# EAGLE board BMSTEST-v1.1 (EAGLE 7.7.0)
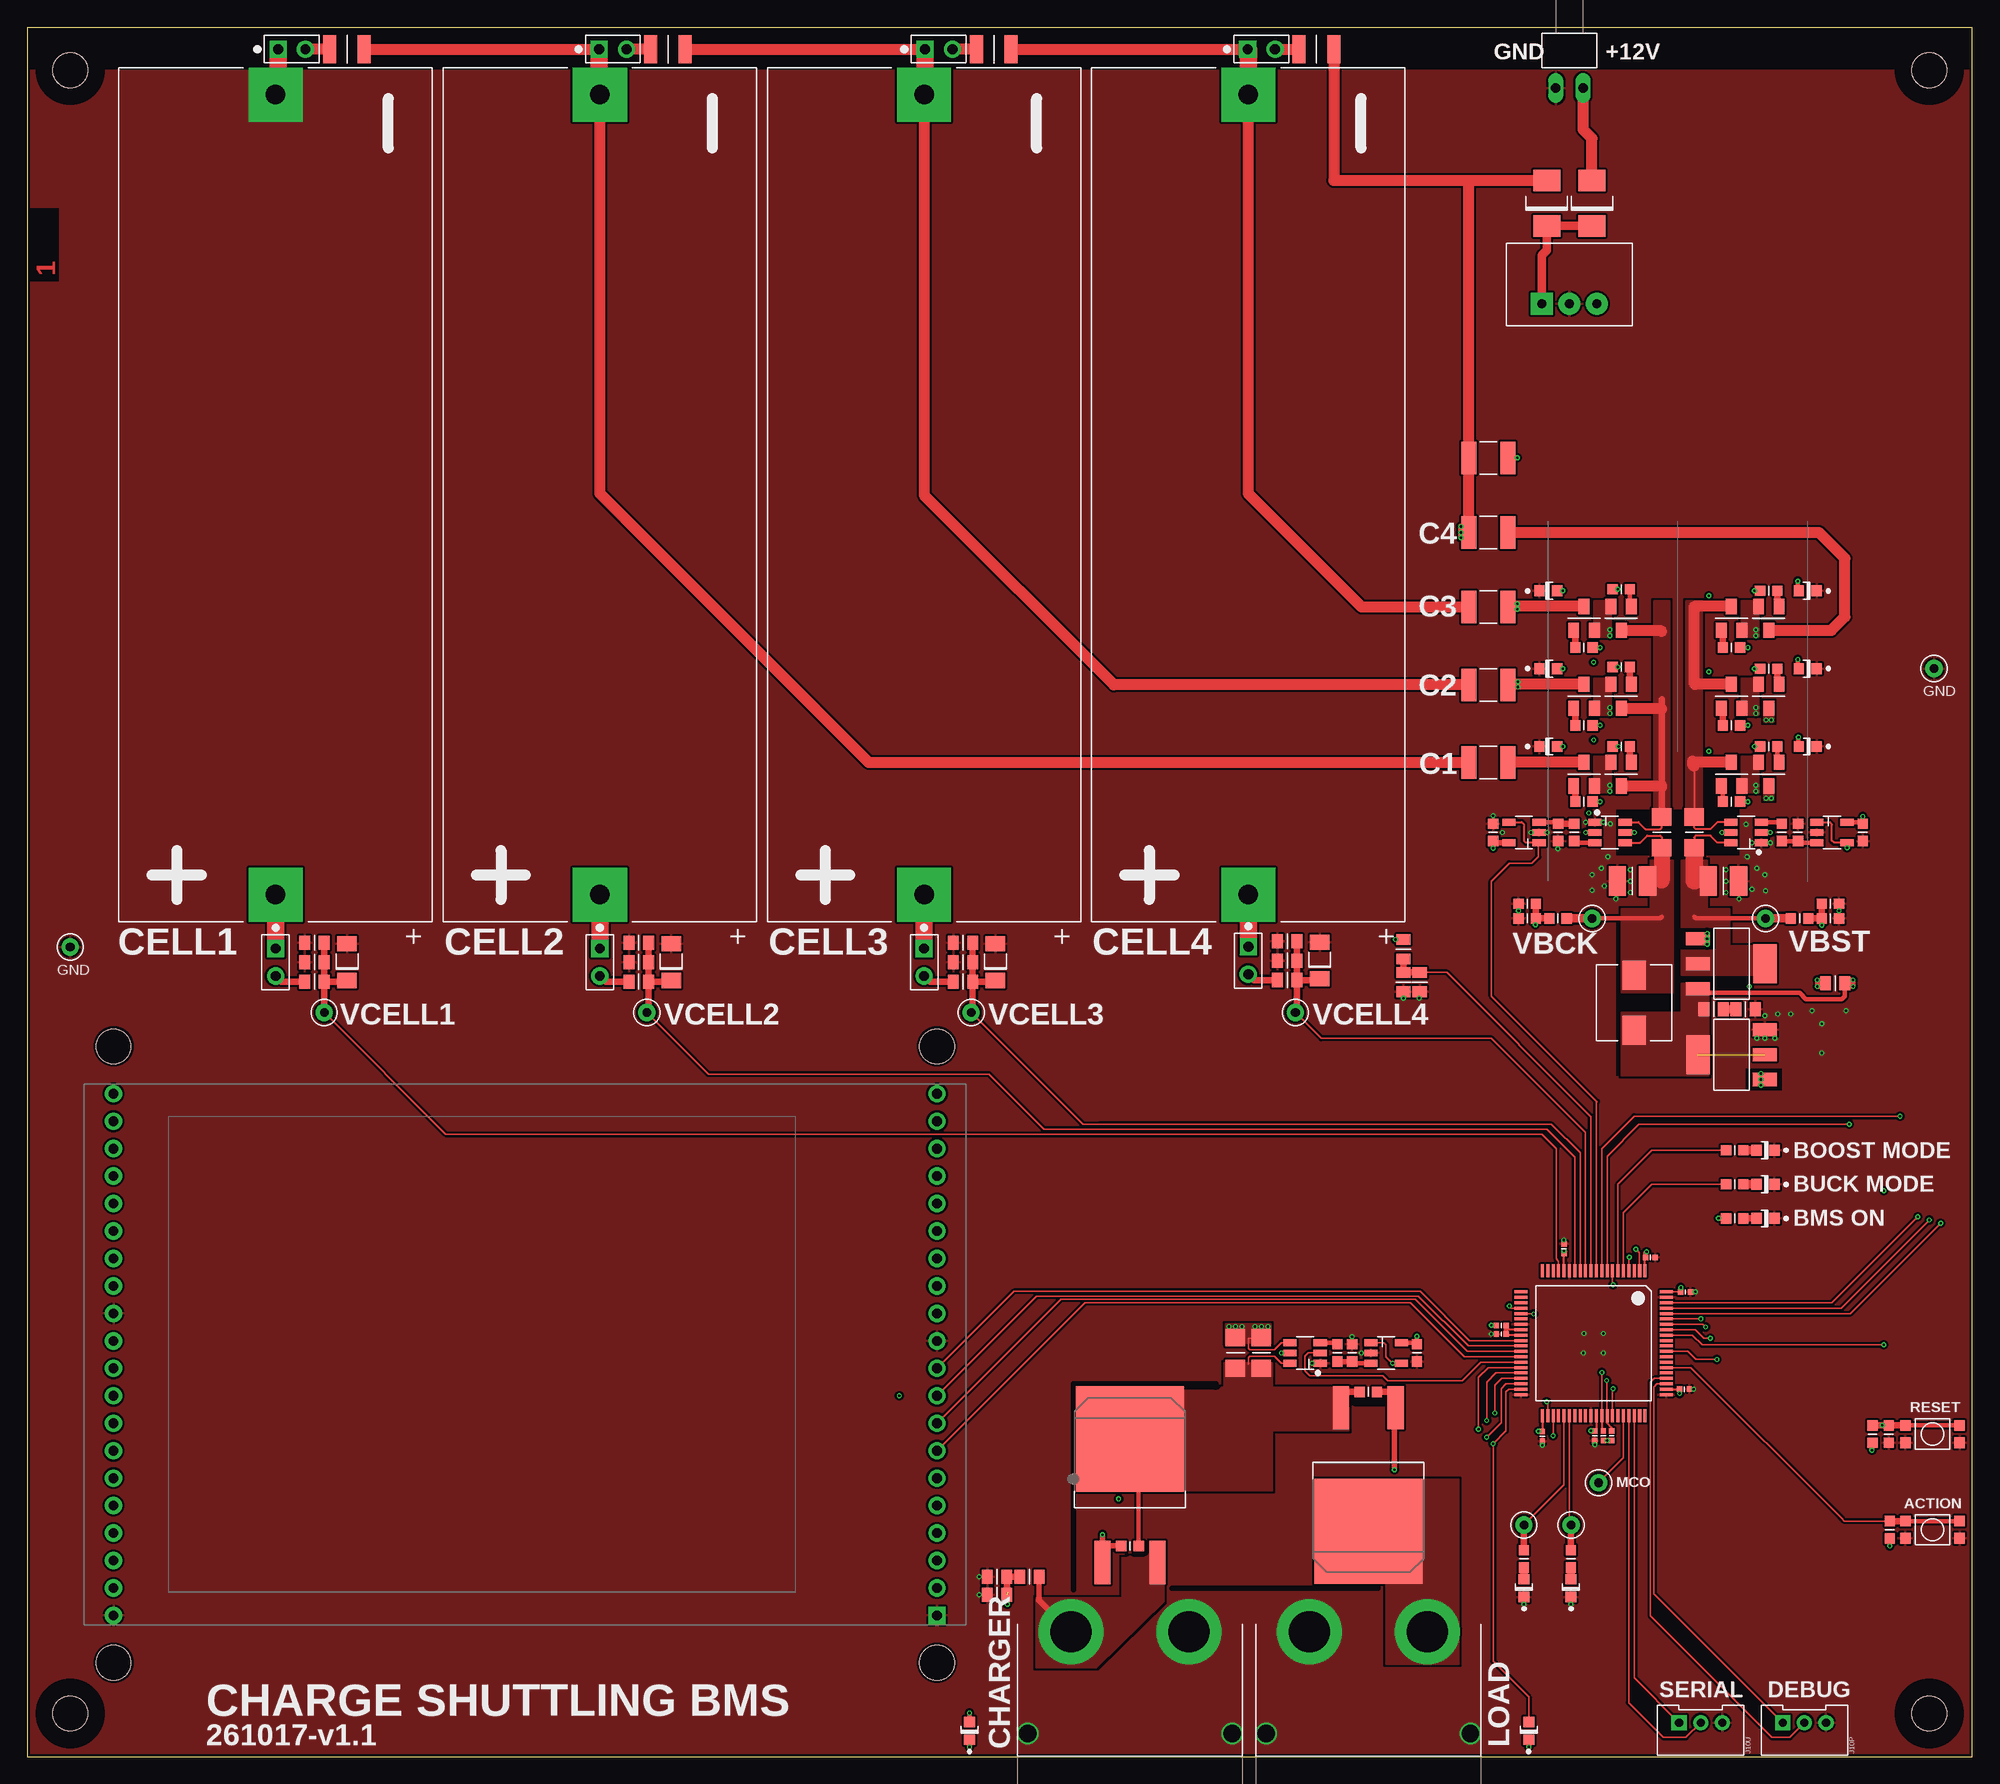
[diagram p4: board, top side]
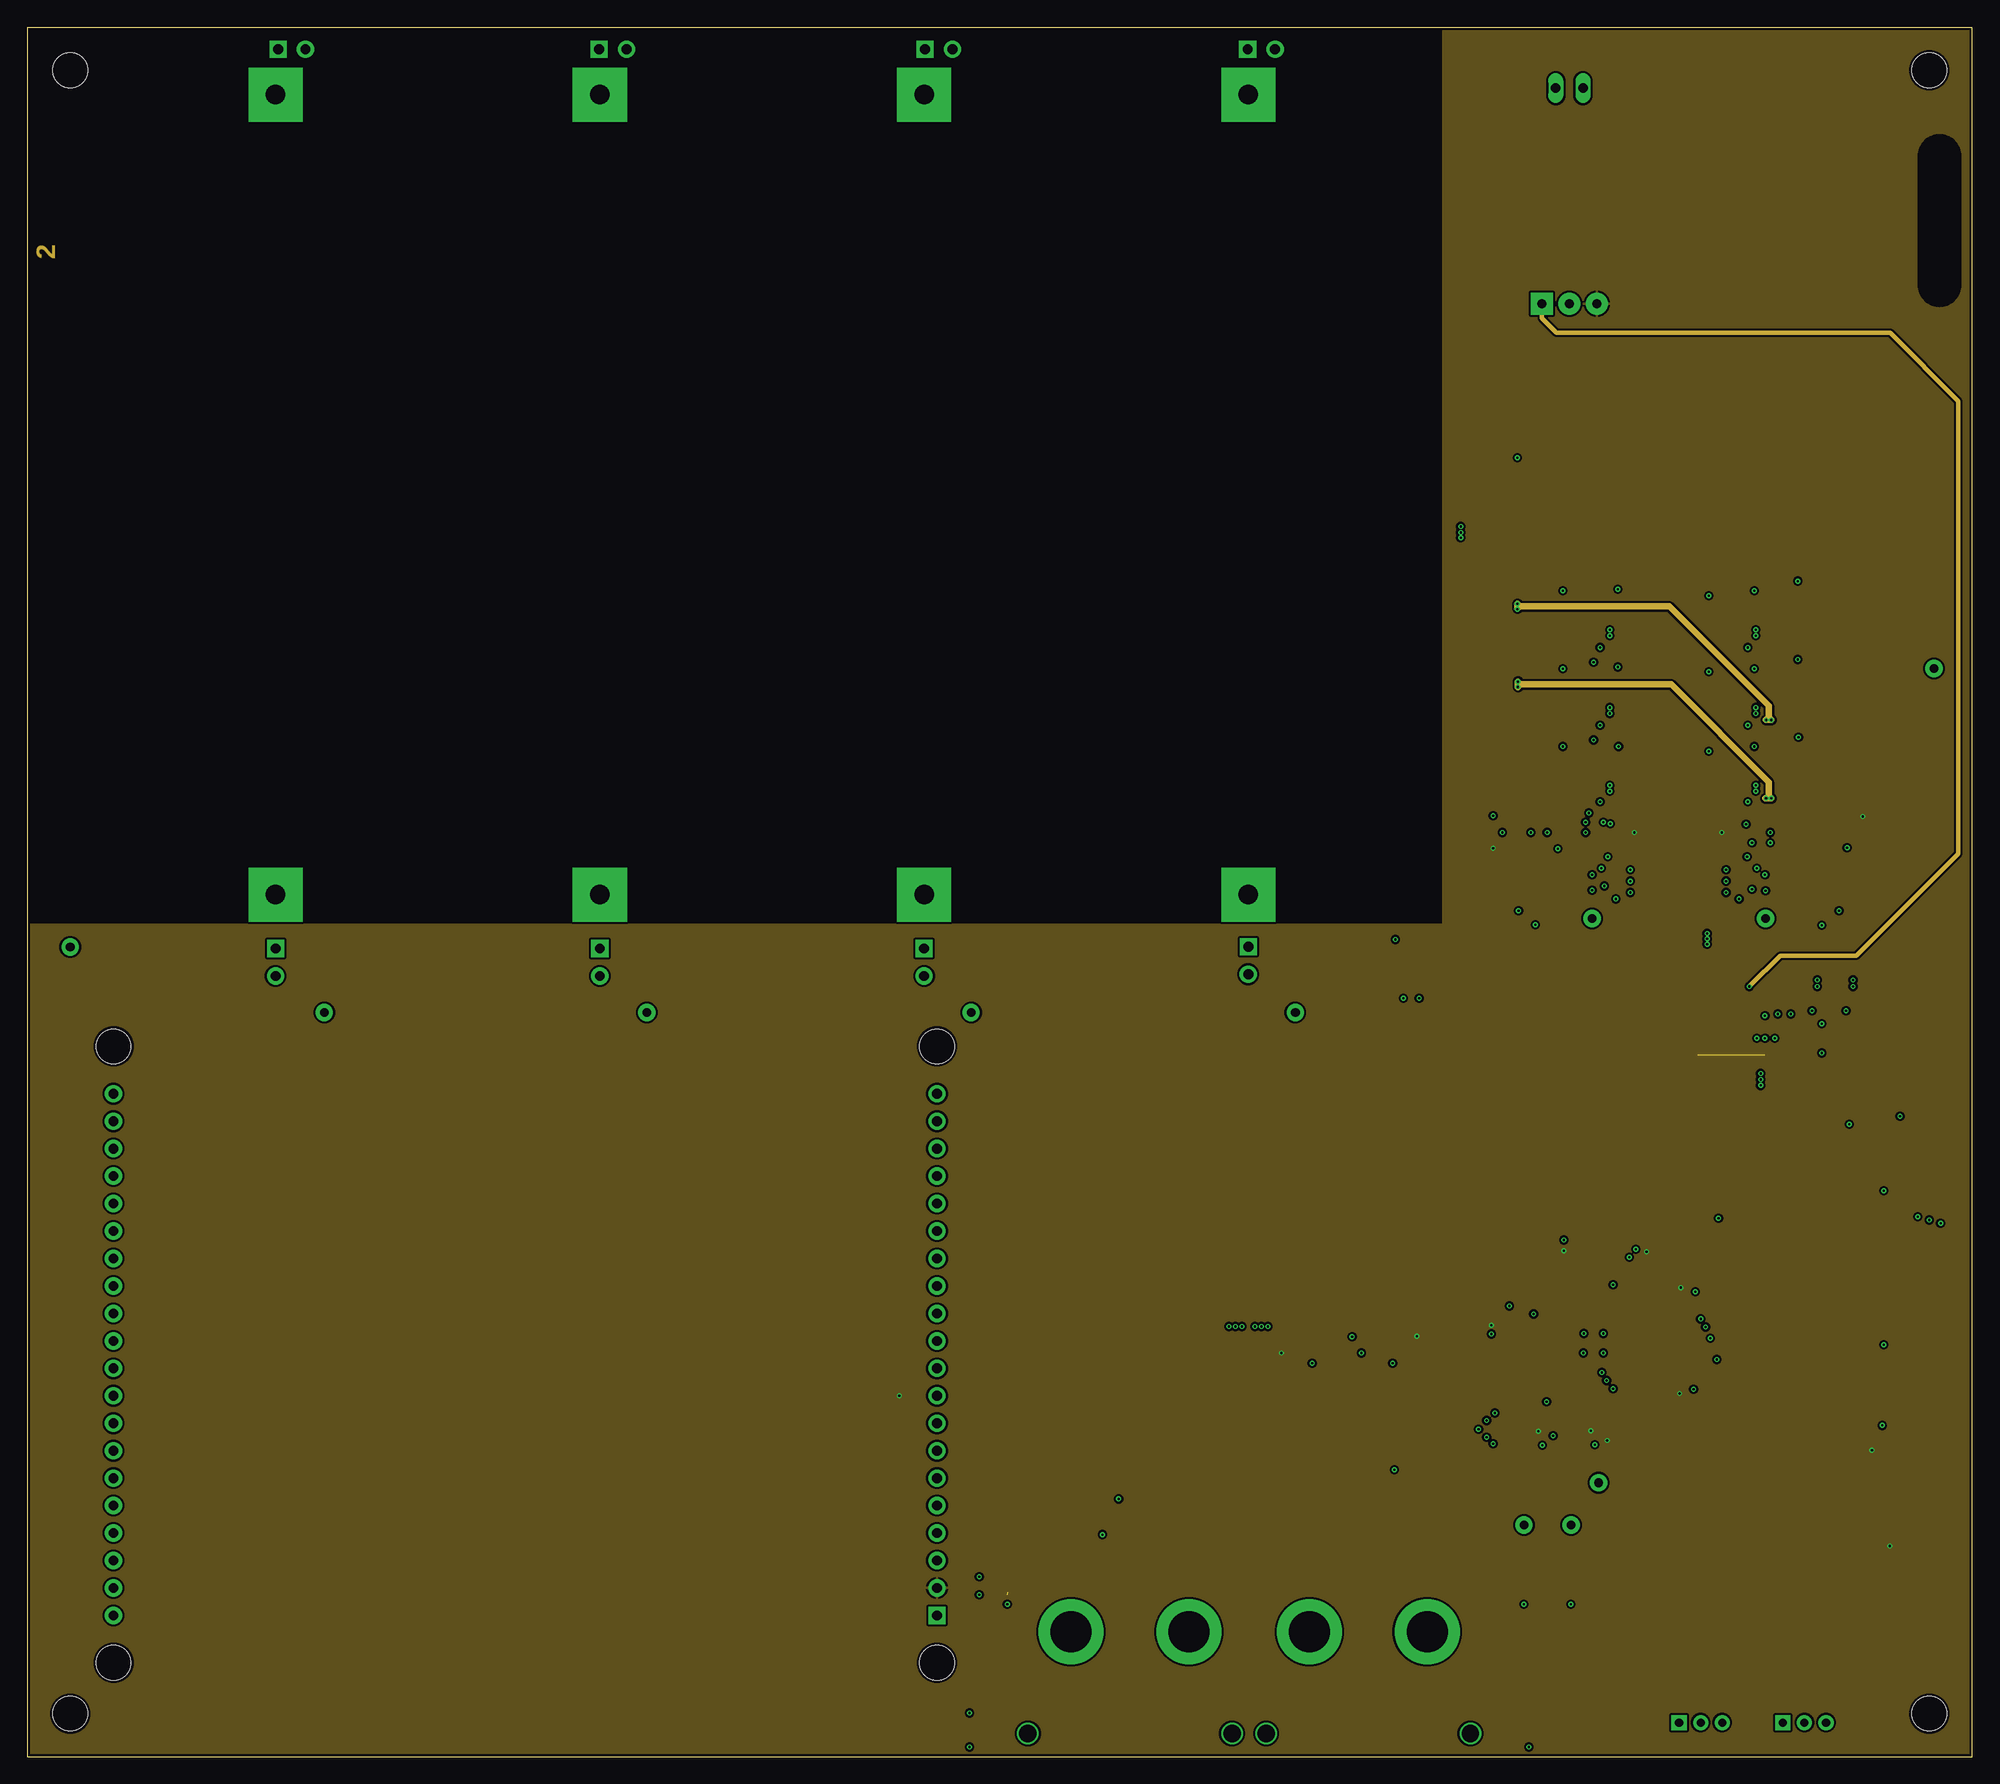
[diagram p5: board, inner layer Route2]
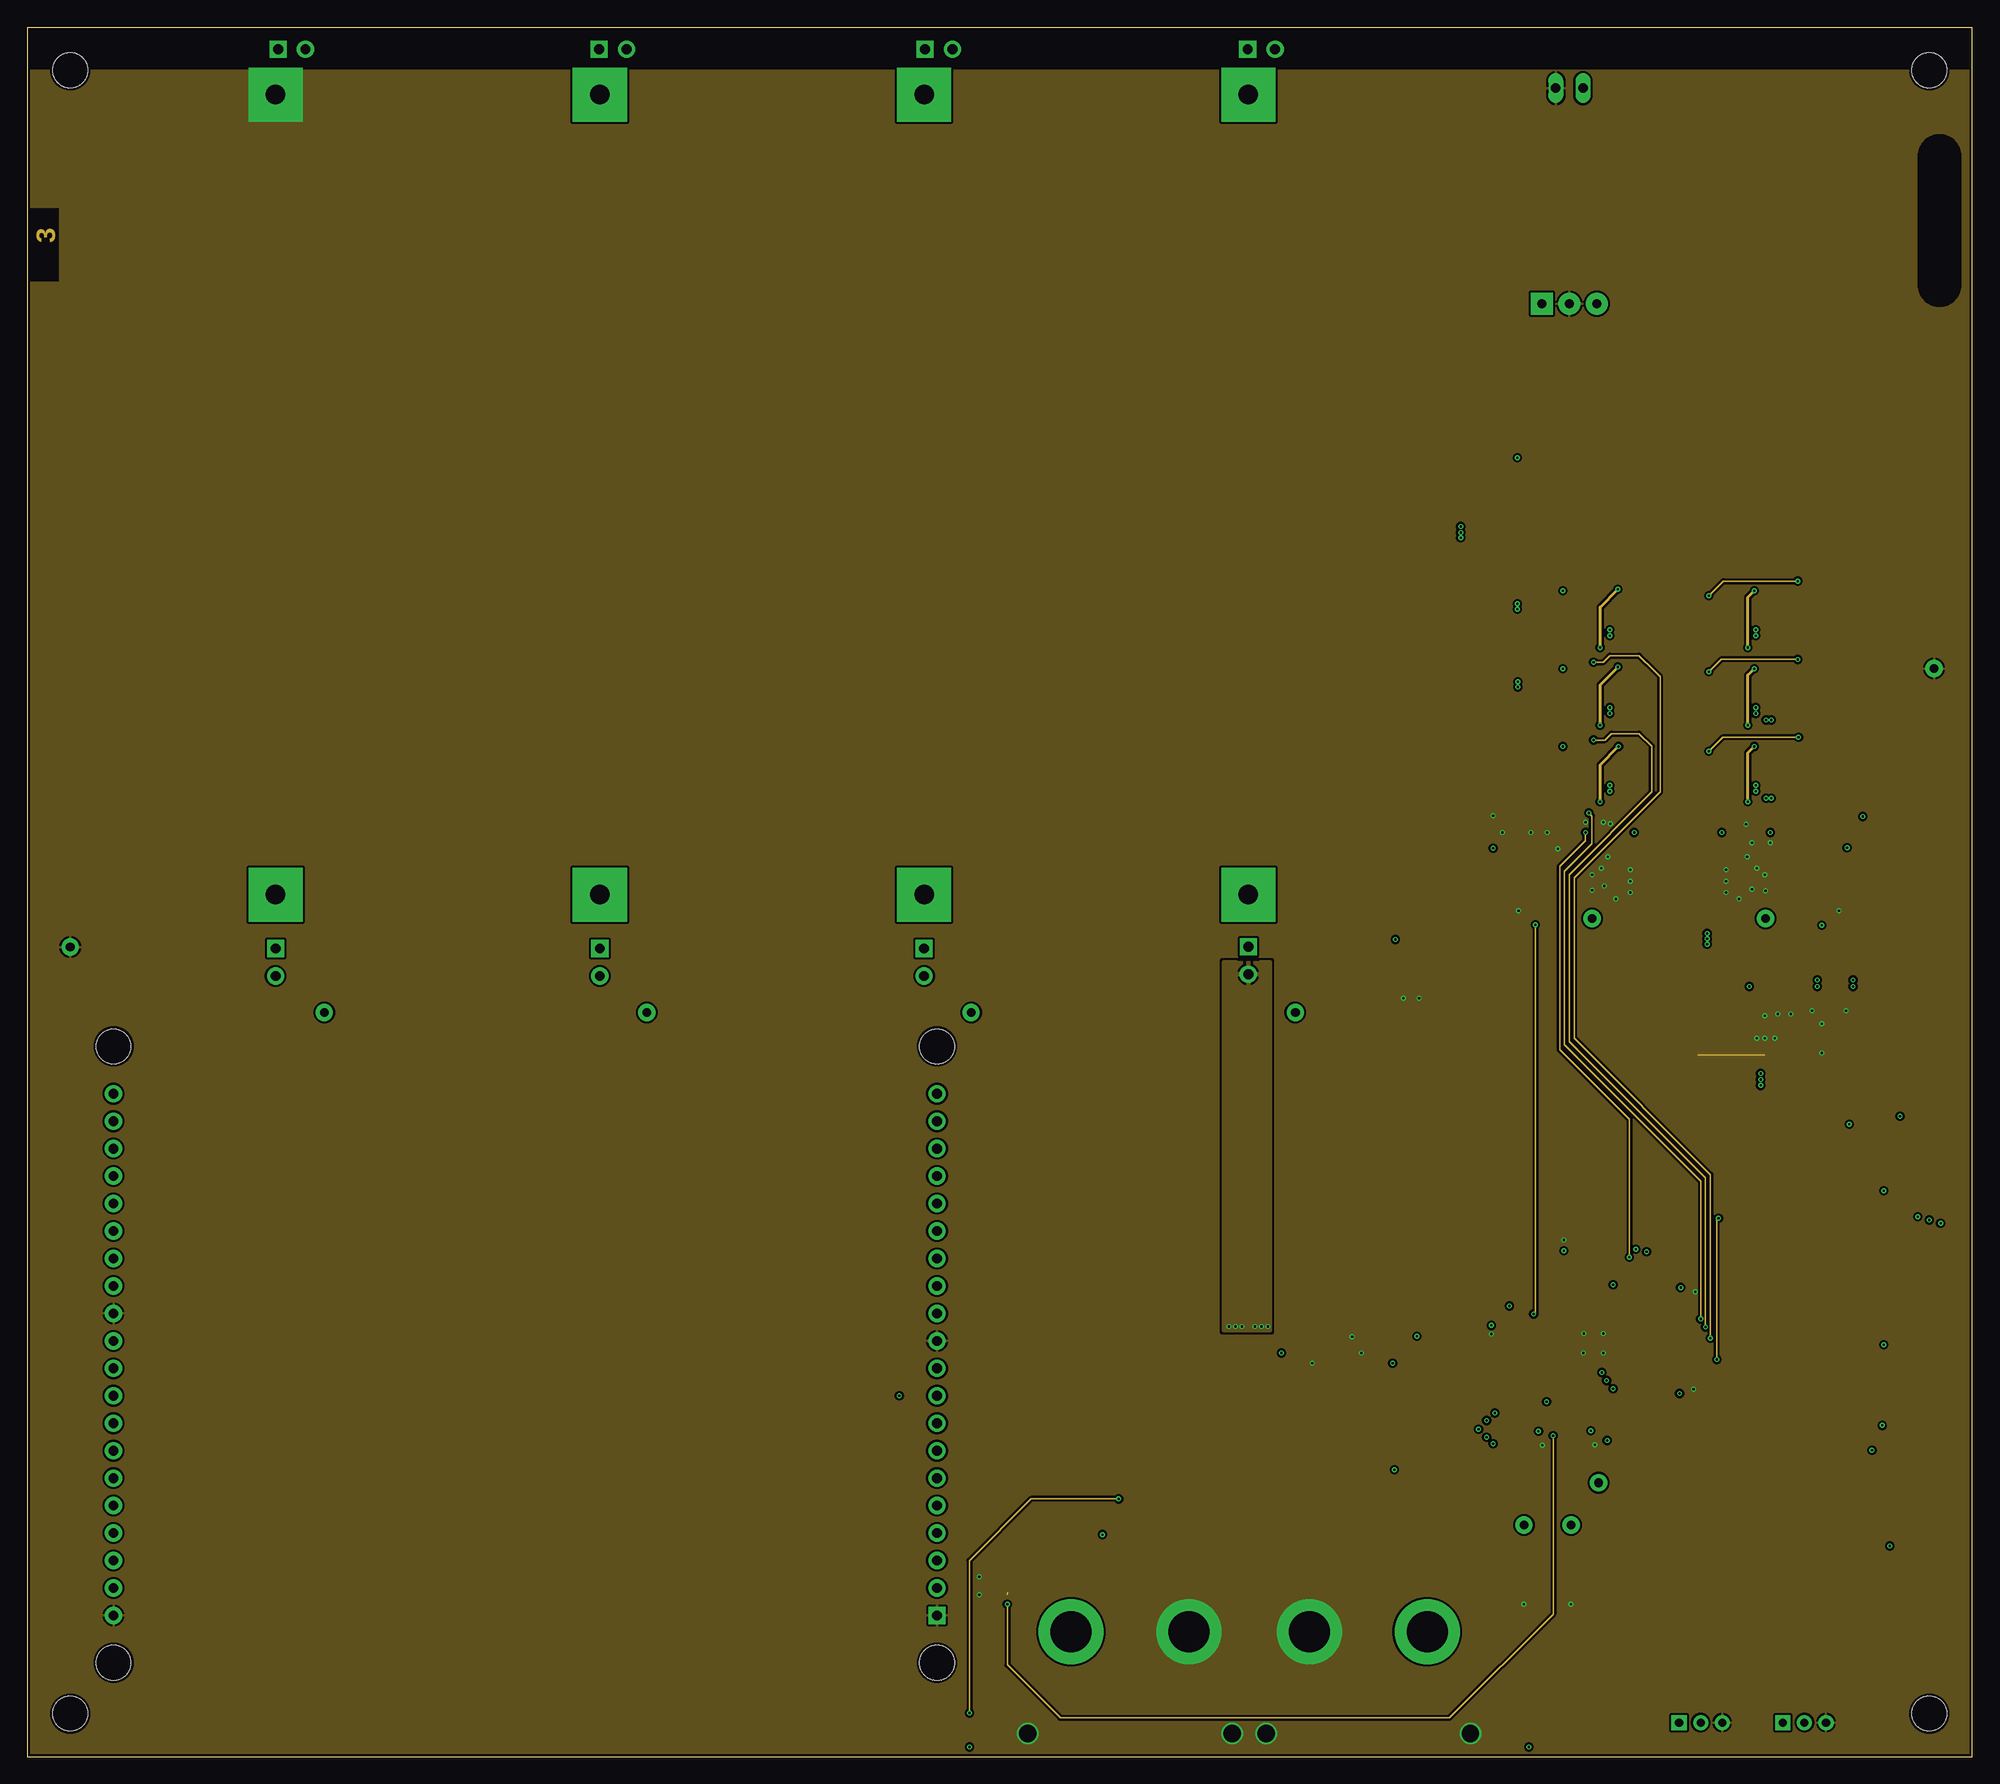
[diagram p6: board, inner layer Route15]
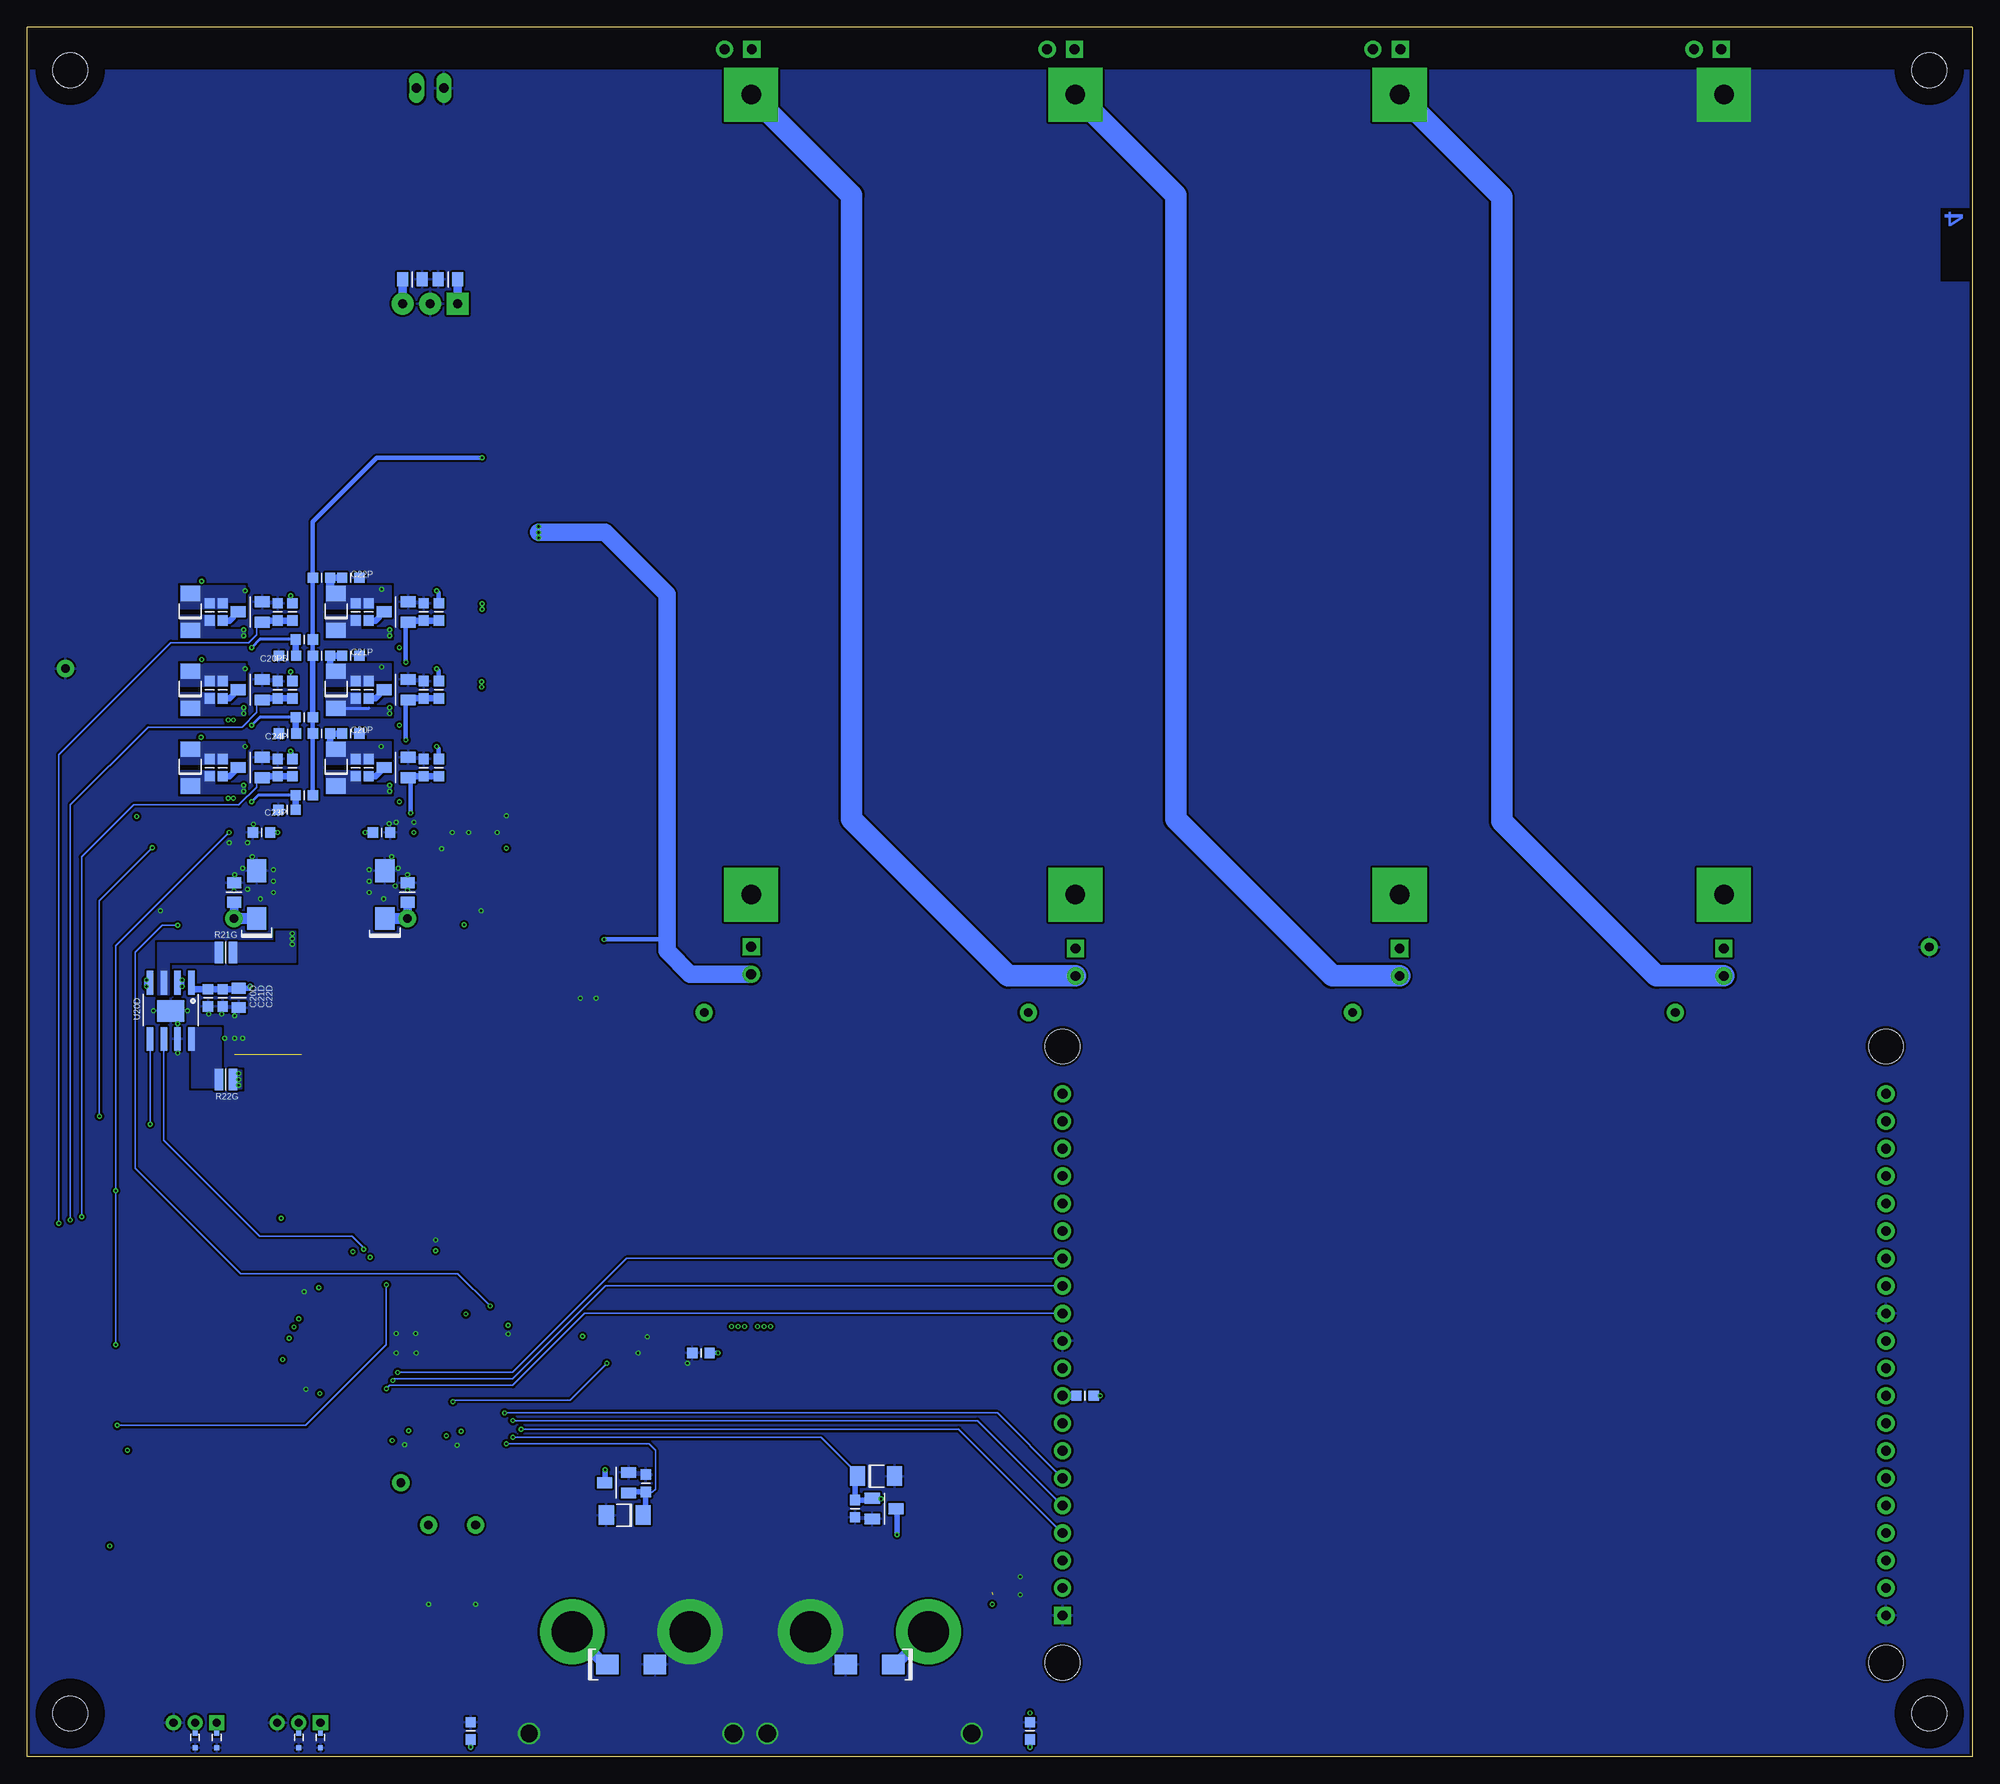
[diagram p7: board, bottom side, seen from below]

Size 180 x 160 mm. Coordinates in mm from the lower left corner, seen from the top.
Outline: 0,160 0,0 180,0 180,160 0,160
Copper layers (1*2*15*16): Top 0.018mm / dielectric 0.36mm / Route2 0.035mm / dielectric 0.71mm / Route15 0.035mm / dielectric 0.36mm / Bottom 0.018mm
Design rules "JLCPCB-4-layer": minimum track width 0.15mm, minimum drill 0.2mm, track to track 0.15mm, track to pad 0.15mm, pad to pad 0.15mm, via to via 0.15mm, smd to smd 0mil, copper to edge 0.25mm, drill to drill 0.3mm, minimum pad ring 0.2mm, minimum via ring 0.125mm, stop-mask expansion 0.1mm, vias tented up to drill 0.25mm, thermal gap 0.2mm
Net classes: 1 dikke power: width 0.4 mm, clearance 0.5 mm
tRestrict: 4 lines

## Footprints (pad centres in the part's own frame; a part is rotated, then mirrored left to right if it is on the bottom)
SWITCH_PUSHBUTTON_KMR742NG = smd 1 x 1: 1 -2.5,0.8; 2 -2.5,-0.8; 3 2.5,-0.8; 4 2.5,0.8
SOT223 = smd 1.219 x 2.235: 1 -2.311,-3.1; 2 0,-3.1; 3 2.311,-3.099 | smd 3.607 x 2.184: 4 0,3.099
CAP0805 = smd 1 x 1.3: 1 -0.9,0; 2 0.9,0
CAP0603 = smd 0.95 x 0.95: 1 -0.8,0; 2 0.8,0
CAP0402 = smd 0.5 x 0.5: 1 -0.45,0; 2 0.45,0
CAP1210 = smd 1.6 x 2.7: 1 -1.4,0; 2 1.4,0
BATTERY_HOLDER_26650 = drill 1.8 pad 5 square: + -37,0; - 37,0
DIODE_SMB = smd 2 x 2.5: A -2.1,0; C 2.1,0
DIODE_SOD523 = smd 0.45 x 0.45: A 0.675,0; C -0.675,0
DIODE_SMA_UNI = smd 2.1 x 1.8: 1 -2.2,0; 2 2.2,0
TSR1-2433 = drill 0.8 pad 2 square: 1 -2.54,0 | drill 0.8 pad 2: 2 0,0; 3 2.54,0
ADAFRUIT_2.8"TFT240X320 = drill 0.9 pad 1.6 square: 1 -38.1,24.13 | drill 0.9 pad 1.6: 2 -38.1,21.59; 3 -38.1,19.05; 4 -38.1,16.51; 5 -38.1,13.97; 6 -38.1,11.43; 7 -38.1,8.89; 8 -38.1,6.35; 9 -38.1,3.81; 10 -38.1,1.27; 11 -38.1,-1.27; 12 -38.1,-3.81; 13 -38.1,-6.35; 14 -38.1,-8.89; 15 -38.1,-11.43; 16 -38.1,-13.97; 17 -38.1,-16.51; 18 -38.1,-19.05; 19 -38.1,-21.59; 20 -38.1,-24.13; 21 38.1,-24.13; 22 38.1,-21.59; 23 38.1,-19.05; 24 38.1,-16.51; 25 38.1,-13.97; 26 38.1,-11.43; 27 38.1,-8.89; 28 38.1,-6.35; 29 38.1,-3.81; 30 38.1,-1.27; 31 38.1,1.27; 32 38.1,3.81; 33 38.1,6.35; 34 38.1,8.89; 35 38.1,11.43; 36 38.1,13.97; 37 38.1,16.51; 38 38.1,19.05; 39 38.1,21.59; 40 38.1,24.13 | hole 3.2: -38.1,-28.5; -38.1,28.5; 38.1,28.5; 38.1,-28.5
POLYFUSE1210 = smd 1.4 x 3: 1 -1.8,0; 2 1.8,0
HOLE_PTH_0.8MM = drill 0.8 pad 1.6: 1 0,0
HOLE_NPTH_3.2MM = hole 3.2: 0,0
CON_XT90PW-M = drill 3.8 pad 6: + 5.45,0; - -5.45,0 | drill 1.6: CASE1 -9.45,9.4; CASE2 9.45,9.4
CON_XT90PW-F = drill 3.8 pad 6: + -5.45,0; - 5.45,0 | drill 1.6: CASE1 -9.45,9.4; CASE2 9.45,9.4
CON_MOLEX_2H = drill 0.9 pad 1.4 long: 1 -1.27,0; 2 1.27,0
CON_JST_B3B-PH-K-S = drill 0.75 pad 1.4 square: 1 -2,0 | drill 0.75 pad 1.4: 2 0,0; 3 2,0
GOLD2 = drill 0.9 pad 1.6 square: 1 -1.27,0 | drill 0.9 pad 1.6: 2 1.27,0
L_0402 = smd 0.5 x 0.5: 1 -0.45,0; 2 0.45,0
L_WE_HCI_6.9X6.9 = smd 2.7 x 2.2: 1 -2.55,0; 2 2.55,0
LED_SMD_0603 = smd 0.95 x 1: A -0.827,0; C 0.827,0
RES0805 = smd 1 x 1.3: 1 -0.9,0; 2 0.9,0
RES0603 = smd 0.95 x 0.95: 1 -0.8,0; 2 0.8,0
RES0402 = smd 0.5 x 0.5: 1 -0.45,0; 2 0.45,0
RES1206 = smd 1.6 x 1.803: 1 -1.422,0; 2 1.422,0
RES0508 = smd 0.8 x 2: 1 -0.65,0; 2 0.65,0
RES1210 = smd 1.2 x 2.6: 1 -1.6,0; 2 1.6,0
PFET_SOT23 = smd 1 x 1.4: 1 -0.95,-1.1; 2 0.95,-1.1; 3 0,1.1
NFET_SOT23 = smd 1 x 1.4: D 0,1.1; G -0.95,-1.1; S 0.95,-1.1
D2PAK = smd 1.5 x 4: 1 -2.54,-8.89; 2 2.54,-8.89 | smd 10 x 9.75: 3 0,2.54
LQFP80 = smd 1.2 x 0.28: 1 -6.725,4.75; 2 -6.725,4.25; 3 -6.725,3.75; 4 -6.725,3.25; 5 -6.725,2.75; 6 -6.725,2.25; 7 -6.725,1.75; 8 -6.725,1.25; 9 -6.725,0.75; 10 -6.725,0.25; 11 -6.725,-0.25; 12 -6.725,-0.75; 13 -6.725,-1.25; 14 -6.725,-1.75; 15 -6.725,-2.25; 16 -6.725,-2.75; 17 -6.725,-3.25; 18 -6.725,-3.75; 19 -6.725,-4.25; 20 -6.725,-4.75; 41 6.725,-4.75; 42 6.725,-4.25; 43 6.725,-3.75; 44 6.725,-3.25; 45 6.725,-2.75; 46 6.725,-2.25; 47 6.725,-1.75; 48 6.725,-1.25; 49 6.725,-0.75; 50 6.725,-0.25; 51 6.725,0.25; 52 6.725,0.75; 53 6.725,1.25; 54 6.725,1.75; 55 6.725,2.25; 56 6.725,2.75; 57 6.725,3.25; 58 6.725,3.75; 59 6.725,4.25; 60 6.725,4.75 | smd 0.28 x 1.2: 21 -4.75,-6.725; 22 -4.25,-6.725; 23 -3.75,-6.725; 24 -3.25,-6.725; 25 -2.75,-6.725; 26 -2.25,-6.725; 27 -1.75,-6.725; 28 -1.25,-6.725; 29 -0.75,-6.725; 30 -0.25,-6.725; 31 0.25,-6.725; 32 0.75,-6.725; 33 1.25,-6.725; 34 1.75,-6.725; 35 2.25,-6.725; 36 2.75,-6.725; 37 3.25,-6.725; 38 3.75,-6.725; 39 4.25,-6.725; 40 4.75,-6.725; 61 4.75,6.725; 62 4.25,6.725; 63 3.75,6.725; 64 3.25,6.725; 65 2.75,6.725; 66 2.25,6.725; 67 1.75,6.725; 68 1.25,6.725; 69 0.75,6.725; 70 0.25,6.725; 71 -0.25,6.725; 72 -0.75,6.725; 73 -1.25,6.725; 74 -1.75,6.725; 75 -2.25,6.725; 76 -2.75,6.725; 77 -3.25,6.725; 78 -3.75,6.725; 79 -4.25,6.725; 80 -4.75,6.725
SOT23-6 = smd 0.62 x 1.22: 1 -0.95,-1.4; 2 0,-1.4; 3 0.95,-1.4; 4 0.95,1.4; 5 0,1.4; 6 -0.95,1.4
SOT23-5 = smd 0.62 x 1.22: 1 -0.95,-1.4; 2 0,-1.4; 3 0.95,-1.4; 4 0.95,1.4; 5 -0.95,1.4
SO8-EP = smd 0.6 x 2.2: 1 -1.905,-2.6; 2 -0.635,-2.6; 3 0.635,-2.6; 4 1.905,-2.6; 5 1.905,2.6; 6 0.635,2.6; 7 -0.635,2.6; 8 -1.905,2.6 | smd 2.5 x 2: EP 0,0
ZENER_SOD80 = smd 1.4 x 1.8: 1 -1.7,0; 2 1.7,0

## Placement (x,y rotation side)
ACTION  KMR742NG  [SWITCH_PUSHBUTTON_KMR742NG]  176.3,21 0 top
BOT  STN3NF06L  [SOT223]  157.7,64.95 90 top
C01A  100N  [CAP0805]  89.75,15 180 top
C01C  100N  [CAP0805]  128.85,71.65 270 top
C01K  100N  [CAP0603]  138.8,78.9 180 top
C01P  10U  [CAP0805]  141.05,136.65 180 bottom
C01T  100N  [CAP0603]  166.85,78.9 0 top
C02P  10U  [CAP0805]  144.35,136.65 0 bottom
C10A  100N  [CAP0402]  136.4,39.1 180 top
C10D  100N  [CAP0402]  142.2,46.99 90 top
C10R  100N  [CAP0603]  172.25,29.85 270 top
C11A  100N  [CAP0402]  150.2,46.2 0 top
C11D  100N  [CAP0402]  140.2,29.65 270 top
C12D  100N  [CAP0402]  153.45,43 0 top
C13D  100N  [CAP0402]  145.05,29.7 270 top
C14D  100N  [CAP0402]  153.35,34 0 top
C20B  100N  [CAP0603]  135.65,85.5 90 top
C20BST  100N  [CAP0805]  167.3,71.55 0 top
C20D  100N  [CAP0603]  161.9,70.2 270 bottom
C20G  1N  [CAP0603]  149.6,91.5 90 bottom
C20N  47U/25V  [CAP1210]  148.55,81 0 top
C20P  1U  [CAP0603]  150.05,94.65 0 bottom
C20P5  1U  [CAP0603]  155.9,101.85 180 bottom
C20S  100N  [CAP0603]  147.2,85.5 0 bottom
C20SN  10N  [CAP0805]  159,69.15 0 top
C20U  47U/25V  [CAP1210]  156.95,81 0 top
C21B  100N  [CAP0603]  169.85,85.5 270 top
C21D  2U2  [CAP0603]  163.25,70.2 270 bottom
C21F  100N  [CAP0603]  141.65,85.5 90 top
C21G  1N  [CAP0603]  149.6,98.7 90 bottom
C21P  1U  [CAP0603]  150.05,101.85 0 bottom
C22D  10U  [CAP0805]  160.4,70.2 270 bottom
C22G  1N  [CAP0603]  149.6,105.9 90 bottom
C22P  1U  [CAP0603]  150.05,109.05 0 bottom
C22S  100N  [CAP0603]  158.3,85.5 180 bottom
C23F  100N  [CAP0603]  163.85,85.5 270 top
C23G  1N  [CAP0603]  163.1,91.5 90 bottom
C23P  1U  [CAP0603]  155.95,87.6 180 bottom
C24G  1N  [CAP0603]  163.1,98.7 90 bottom
C24P  1U  [CAP0603]  155.9,94.65 180 bottom
C25G  1N  [CAP0603]  163.1,105.9 90 bottom
C30B  100N  [CAP0603]  128.6,37.35 270 top
C30C  100N  [CAP0805]  26.6,75.3 180 top
C30S  100N  [CAP0603]  122.6,37.35 270 top
C31C  100N  [CAP0805]  56.6,75.3 180 top
C31S  100N  [CAP0603]  117.65,37.35 180 bottom
C32C  100N  [CAP0805]  86.6,73.5 180 top
C33C  100N  [CAP0805]  116.6,75.45 180 top
CELL1  IFR266650  [BATTERY_HOLDER_26650]  23,116.75 90 top
CELL2  IFR266650  [BATTERY_HOLDER_26650]  53,116.75 90 top
CELL3  IFR266650  [BATTERY_HOLDER_26650]  83,116.75 90 top
CELL4  IFR266650  [BATTERY_HOLDER_26650]  113,116.75 90 top
D01P  10BQ030  [DIODE_SMB]  144.8,143.7 270 top
D02P  10BQ030  [DIODE_SMB]  140.6,143.7 270 top
D10P  ESD5Z5.0T1G  [DIODE_SOD523]  162.45,1.5 270 bottom
D10U  ESD5Z5.0T1G  [DIODE_SOD523]  152.85,1.5 270 bottom
D11P  ESD5Z5.0T1G  [DIODE_SOD523]  164.45,1.5 270 bottom
D11U  ESD5Z5.0T1G  [DIODE_SOD523]  154.85,1.5 270 bottom
D30P  SMAJ15A  [DIODE_SMA_UNI]  102.05,8.55 180 bottom
D31P  SMAJ15A  [DIODE_SMA_UNI]  124.1,8.55 0 bottom
DC01P  TSR1-2433  [TSR1-2433]  142.7,134.4 0 top
DSP11  ADAFRUIT_2.8"TFT240X320  [ADAFRUIT_2.8"TFT240X320]  46.1,37.2 180 top
F30C  0ZCH0110AF2E  [POLYFUSE1210]  135.2,91.95 0 top
F31C  0ZCH0110AF2E  [POLYFUSE1210]  135.2,99.15 0 top
F32C  0ZCH0110AF2E  [POLYFUSE1210]  135.2,106.35 0 top
F33C  0ZCH0110AF2E  [POLYFUSE1210]  135.2,113.25 0 top
F34C  0ZCH0110AF2E  [POLYFUSE1210]  135.2,120.15 0 top
GND1  PIN_TEST  [HOLE_PTH_0.8MM]  4,74.9 90 top
GND2  PIN_TEST  [HOLE_PTH_0.8MM]  176.45,100.65 0 top
GRN  PIN_TEST  [HOLE_PTH_0.8MM]  142.85,21.45 90 top
H1  HOLE_NPTH_3.2MM  [HOLE_NPTH_3.2MM]  4,4 0 top
H2  HOLE_NPTH_3.2MM  [HOLE_NPTH_3.2MM]  176,4 0 top
H3  HOLE_NPTH_3.2MM  [HOLE_NPTH_3.2MM]  4,156 0 top
H4  HOLE_NPTH_3.2MM  [HOLE_NPTH_3.2MM]  176,156 0 top
J01I  CON_XT90PW-M  [CON_XT90PW-M]  102.05,11.55 180 top
J01O  CON_XT90PW-F  [CON_XT90PW-F]  124.1,11.55 180 top
J01P  CON_MOLEX_2H  [CON_MOLEX_2H]  142.7,154.35 180 top
J10P  CON_JST_B3B-PH-K-S  [CON_JST_B3B-PH-K-S]  164.45,3.15 0 top
J10U  CON_JST_B3B-PH-K-S  [CON_JST_B3B-PH-K-S]  154.85,3.15 0 top
J30B  GOLD2  [GOLD2]  24.5,157.95 0 top
J30C  GOLD2  [GOLD2]  23,73.5 270 top
J31B  GOLD2  [GOLD2]  54.2,157.95 0 top
J31C  GOLD2  [GOLD2]  53,73.5 270 top
J32B  GOLD2  [GOLD2]  84.35,157.95 0 top
J32C  GOLD2  [GOLD2]  83,73.5 270 top
J33B  GOLD2  [GOLD2]  114.2,157.95 0 top
J33C  GOLD2  [GOLD2]  113,73.65 270 top
L10A  MMZ1005A222ETD25  [L_0402]  136.4,39.9 0 top
L20  47U  [L_WE_HCI_6.9X6.9]  148.7,69.75 90 top
LD10-R  RED  [LED_SMD_0603]  138.5,15.6 270 top
LD11-G  GRN  [LED_SMD_0603]  142.85,15.6 270 top
LD12-R  RED  [LED_SMD_0603]  160.85,52.95 0 top
LD13-G  GRN  [LED_SMD_0603]  160.85,56.1 0 top
LD13-Y  YEL  [LED_SMD_0603]  160.85,49.8 0 top
LD20  RED  [LED_SMD_0603]  140.75,93.45 180 top
LD21  RED  [LED_SMD_0603]  140.75,100.65 180 top
LD22  RED  [LED_SMD_0603]  140.75,107.85 180 top
LD23  GRN  [LED_SMD_0603]  164.75,93.45 0 top
LD24  GRN  [LED_SMD_0603]  164.75,100.65 0 top
LD25  GRN  [LED_SMD_0603]  164.75,107.85 0 top
LD31I  RED  [LED_SMD_0603]  87.2,2.4 270 top
LD31O  RED  [LED_SMD_0603]  138.95,2.4 270 top
MCO  PIN_TEST  [HOLE_PTH_0.8MM]  145.4,25.35 0 top
R01A  130K/1%  [RES0805]  92.75,16.65 0 top
R01C  130K/1%  [RES0805]  127.35,74.7 90 top
R01K  130K/1%  [RES0603]  141.65,77.55 0 top
R01T  130K/1%  [RES0603]  164,77.55 180 top
R02A  30K/1%  [RES0805]  89.75,16.65 0 top
R02C  30K/1%  [RES0805]  127.35,71.65 90 top
R02K  30K/1%  [RES0603]  138.8,77.55 0 top
R02T  30K/1%  [RES0603]  166.85,77.55 180 top
R10A  10K  [RES0603]  172.35,21 270 top
R10D  10K  [RES0603]  82.1,33.4 180 bottom
R10I  2K2  [RES0402]  145.85,29.7 270 top
R10L  3K3  [RES0603]  138.5,18.3 270 top
R10R  NOPOP  [RES0603]  170.75,29.85 270 top
R11I  2K2  [RES0402]  146.6,29.7 270 top
R11L  3K3  [RES0603]  142.85,18.3 270 top
R12L  3K3  [RES0603]  158,52.95 0 top
R13L  3K3  [RES0603]  158,56.1 0 top
R14L  3K3  [RES0603]  158,49.8 0 top
R20A  22R  [RES0603]  147.5,93.45 180 top
R20B  22R  [RES0603]  144.05,88.35 180 top
R20C  10mR  [RES1206]  151.25,85.5 90 top
R20D  10K  [RES0603]  143.3,91.5 270 bottom
R20F  1K  [RES0603]  143.15,85.5 90 top
R20L  3K3  [RES0603]  141.9,91.5 270 bottom
R20N  10K  [RES0805]  144.8,79.95 90 bottom
R20P  10K  [RES0603]  152.75,94.65 0 bottom
R20S  100R  [RES0603]  148.4,91.5 270 bottom
R20SN  4R7  [RES0805]  156.05,69.15 0 top
R20U  10K  [RES0805]  160.85,79.95 90 bottom
R21A  22R  [RES0603]  147.5,100.8 180 top
R21B  22R  [RES0603]  144.05,95.4 180 top
R21D  10K  [RES0603]  143.3,98.7 270 bottom
R21F  1K  [RES0603]  162.35,85.5 270 top
R21G  1R  [RES0508]  161.6,74.4 0 bottom
R21L  3K3  [RES0603]  141.9,98.7 270 bottom
R21P  10K  [RES0603]  152.75,101.85 0 bottom
R21S  1K  [RES0603]  148.4,98.7 270 bottom
R22A  22R  [RES0603]  147.5,108 180 top
R22B  22R  [RES0603]  144.05,102.6 180 top
R22D  10K  [RES0603]  143.3,105.9 270 bottom
R22G  4R7  [RES0508]  161.6,62.65 0 bottom
R22L  3K3  [RES0603]  141.9,105.9 270 bottom
R22P  10K  [RES0603]  152.75,109.05 0 bottom
R22S  1K  [RES0603]  148.4,105.9 270 bottom
R23A  22R  [RES0603]  157.7,88.35 180 top
R23B  22R  [RES0603]  161.15,93.45 180 top
R23D  10K  [RES0603]  156.8,91.5 270 bottom
R23L  3K3  [RES0603]  155.45,91.5 270 bottom
R23P  10K  [RES0603]  154.35,88.95 180 bottom
R23S  1K  [RES0603]  161.9,91.5 270 bottom
R24A  22R  [RES0603]  157.7,95.4 180 top
R24B  22R  [RES0603]  161.15,100.65 180 top
R24D  10K  [RES0603]  156.8,98.7 270 bottom
R24L  3K3  [RES0603]  155.45,98.7 270 bottom
R24P  10K  [RES0603]  154.35,96.15 180 bottom
R24S  1K  [RES0603]  161.9,98.7 270 bottom
R25A  22R  [RES0603]  157.7,102.6 180 top
R25B  22R  [RES0603]  161.15,107.85 180 top
R25D  10K  [RES0603]  156.8,105.9 270 bottom
R25L  3K3  [RES0603]  155.45,105.9 270 bottom
R25P  10K  [RES0603]  154.35,103.35 180 bottom
R25S  1K  [RES0603]  161.9,105.9 270 bottom
R30B  33R  [RES1210]  29.6,157.95 0 top
R30C  30K  [RES0805]  26.6,73.5 180 top
R30I  10K  [RES0603]  102.05,19.5 180 top
R30O  10K  [RES0603]  124.1,33.75 0 top
R30P  10mR  [RES1206]  111.8,37.35 90 top
R30S  1K  [RES0603]  121.25,37.35 270 top
R31B  33R  [RES1210]  59.3,157.95 0 top
R31C  130K  [RES0805]  26.6,71.7 0 top
R31L  4K7  [RES0603]  87.2,2.4 90 bottom
R31P  10mR  [RES1206]  114.2,37.35 90 top
R32B  33R  [RES1210]  89.45,157.95 0 top
R32C  30K  [RES0805]  56.6,73.5 180 top
R32I  10K  [RES0603]  103.4,22.95 270 bottom
R32O  10K  [RES0603]  122.75,25.3 90 bottom
R33B  33R  [RES1210]  119.3,157.95 0 top
R33C  130K  [RES0805]  56.6,71.7 0 top
R33L  4K7  [RES0603]  138.95,2.4 90 bottom
R34C  30K  [RES0805]  86.6,75.3 180 top
R35C  130K  [RES0805]  86.6,71.7 0 top
R36C  30K  [RES0805]  116.6,73.65 180 top
R37C  130K  [RES0805]  116.6,71.85 0 top
RED  PIN_TEST  [HOLE_PTH_0.8MM]  138.5,21.45 90 top
RESET  KMR742NG  [SWITCH_PUSHBUTTON_KMR742NG]  176.3,29.85 0 top
RS20U  10mR  [RES1206]  154.25,85.5 90 top
T20A  SI2393DS-T1-GE3  [PFET_SOT23]  147.5,90.9 180 top
T20B  SI2393DS-T1-GE3  [PFET_SOT23]  144.05,90.9 0 top
T20S  TSM2306CX  [NFET_SOT23]  145.85,91.5 90 bottom
T21A  SI2393DS-T1-GE3  [PFET_SOT23]  147.5,98.1 180 top
T21B  SI2393DS-T1-GE3  [PFET_SOT23]  144.05,98.1 0 top
T21S  TSM2306CX  [NFET_SOT23]  145.85,98.7 90 bottom
T22A  SI2393DS-T1-GE3  [PFET_SOT23]  147.5,105.3 180 top
T22B  SI2393DS-T1-GE3  [PFET_SOT23]  144.05,105.3 0 top
T22S  TSM2306CX  [NFET_SOT23]  145.85,105.9 90 bottom
T23A  SI2393DS-T1-GE3  [PFET_SOT23]  157.7,90.9 0 top
T23B  SI2393DS-T1-GE3  [PFET_SOT23]  161.15,90.9 180 top
T23S  TSM2306CX  [NFET_SOT23]  159.35,91.5 90 bottom
T24A  SI2393DS-T1-GE3  [PFET_SOT23]  157.7,98.1 0 top
T24B  SI2393DS-T1-GE3  [PFET_SOT23]  161.15,98.1 180 top
T24S  TSM2306CX  [NFET_SOT23]  159.35,98.7 90 bottom
T25A  SI2393DS-T1-GE3  [PFET_SOT23]  157.7,105.3 0 top
T25B  SI2393DS-T1-GE3  [PFET_SOT23]  161.15,105.3 180 top
T25S  TSM2306CX  [NFET_SOT23]  159.35,105.9 90 bottom
T30I  GSFT06130  [D2PAK]  102.05,26.85 0 top
T30O  GSFT06130  [D2PAK]  124.1,23.4 180 top
T31I  BSS123-7-F  [NFET_SOT23]  100.7,22.95 270 bottom
T32O  BSS123-7-F  [NFET_SOT23]  125.45,25.35 90 bottom
TOP  STN3NF06L  [SOT223]  157.7,73.35 270 top
U10  STM32G474MCT6  [LQFP80]  144.95,38.25 270 top
U20  TS1103-200  [SOT23-6]  146.45,85.5 270 top
U20B  AD8605ARTZ  [SOT23-5]  138.5,85.5 90 top
U20D  UCC27211A-Q1  [SO8-EP]  166.7,69 180 bottom
U21  TS1103-200  [SOT23-6]  159.05,85.5 90 top
U21B  AD8605ARTZ  [SOT23-5]  167,85.5 270 top
U30  TS1103-200  [SOT23-6]  118.25,37.35 90 top
U30B  AD8605ARTZ  [SOT23-5]  125.75,37.35 270 top
VBCK  PIN_TEST  [HOLE_PTH_0.8MM]  144.8,77.55 90 top
VBST  PIN_TEST  [HOLE_PTH_0.8MM]  160.85,77.55 90 top
VCELL1  PIN_TEST  [HOLE_PTH_0.8MM]  27.5,68.85 0 top
VCELL2  PIN_TEST  [HOLE_PTH_0.8MM]  57.35,68.85 0 top
VCELL3  PIN_TEST  [HOLE_PTH_0.8MM]  87.35,68.85 0 top
VCELL4  PIN_TEST  [HOLE_PTH_0.8MM]  117.35,68.85 0 top
Z20C  5V6  [ZENER_SOD80]  29.6,73.5 270 top
Z20G  12V  [ZENER_SOD80]  151.4,91.5 270 bottom
Z20N  SMAJ15A  [DIODE_SMA_UNI]  146.9,79.75 90 bottom
Z20U  SMAJ15A  [DIODE_SMA_UNI]  158.75,79.75 90 bottom
Z21C  5V6  [ZENER_SOD80]  59.6,73.5 270 top
Z21G  12V  [ZENER_SOD80]  151.4,98.7 270 bottom
Z22C  5V6  [ZENER_SOD80]  89.6,73.5 270 top
Z22G  12V  [ZENER_SOD80]  151.4,105.9 270 bottom
Z23C  5V6  [ZENER_SOD80]  119.6,73.65 270 top
Z23G  12V  [ZENER_SOD80]  164.9,91.5 270 bottom
Z24G  12V  [ZENER_SOD80]  164.9,98.7 270 bottom
Z25G  12V  [ZENER_SOD80]  164.9,105.9 270 bottom
Z30I  3V6  [ZENER_SOD80]  101.45,25.95 180 bottom
Z30O  3V6  [ZENER_SOD80]  124.7,22.35 0 bottom

## Tracks (layer width: path | path; a pad name or v marks a point on that pad's centre or on a via)
!IN_ON  (via drill 0.2 pad 0.4)
  Top 0.5: T30I.1 99.5,19.5 | 99.5,19.5 v99.5,20.55 | R30I.2 99.5,19.5
  Top 0.6: 99.5,16.5 T30I.1
  Bottom 0.5: v99.5,20.55 99.5,22.85 T31I.D
!OLED_CS
  Top 0.15: U10.33 133,37 128,42 97.89,42 DSP11.7
!OLED_RESET
  Top 0.15: DSP11.9 93.41,42.6 128.75,42.6 133.35,38 U10.31
  Bottom 0.4: DSP11.9
  Bottom 0.8: R10D.2 DSP11.9
!OUT_ON  (via drill 0.2 pad 0.4)
  Top 0.5: v126.5,26.55 126.5,32.15 T30O.1
  Top 0.6: R30O.2 126.65,33.75 T30O.1 126.53,32.4
  Bottom 0.5: T32O.D 126.5,25.4 v126.5,26.55
!RST  (via drill 0.2 pad 0.4)
  Top 0.15: U10.7 146.7,43.7 v146.75,43.65 146.82,43.58
  Top 0.4: RESET.4 RESET.1 | RESET.1 173.65,30.65 173.6,30.6 173.75,30.6 RESET.1
  Top 0.6: RESET.1 C10R.1 v171.65,30.65 R10R.1
  Bottom 0.15: v171.65,30.65 154.2,30.65 146.75,38.1 v146.75,43.65
!TOUCH_IRQ  (via drill 0.2 pad 0.4)
  Top 0.15: U10.54 146.7,34 v146.75,34.05
  Bottom 0.15: v146.75,34.05 146.45,34.35 135.05,34.35 128.39,41.01 DSP11.12
ACTION
  Top 0.15: 172.37,21.8 R10A.1 168.15,21.8 167.9,22.05 167.75,22.2 153.95,36 U10.66
  Top 0.4: ACTION.4 ACTION.1
  Top 0.6: ACTION.1 172.37,21.8
C1+
  Top 1.6: J30C.1 CELL1.+
C1_FUSED
  Top 0.6: 137.5,92 137.05,92 F30C.2
  Top 1: T20B.3 137.5,92
C2+
  Top 1.6: J31C.1 CELL2.+
C2_FUSED  (via drill 0.2 pad 0.4)
  Top 0.15: F31C.2 137.65,99.15 | 137.65,99.15 v137.95,99.45 | 137.65,99.15 137.65,99.19 137.66,99.2
  Top 1: T21B.3 137.66,99.2
  Route2 0.6: v137.95,99.45 137.95,99.18 | 137.95,99.18 v137.95,98.95 | 137.95,99.18 152.12,99.18 161.15,90.15 161.15,88.65 | 161.15,88.65 161.3,88.65 v161.4,88.65 | 160.85,88.65 161.15,88.65
  other vias: 160.9,88.65
  pour Top (no thermals): 160.7,88.5 160.7,90.45 161.6,90.45 161.6,88.5
C3+
  Top 1.6: J32C.1 CELL3.+
C3_FUSED  (via drill 0.2 pad 0.4)
  Top 0.6: T24B.3 161.3,97
  Top 1: T22B.3 137.65,106.4
  Route2 0.6: v137.9,106.65 137.9,106.4 | 137.9,106.4 137.9,106.2 | 137.9,106.4 151.95,106.4 161.15,97.2 161.15,95.9 v161.4,95.9 v160.9,95.9
  other vias: 137.9,106.15
  pour Top (no thermals): 136.85,105 136.85,106.8 138.35,106.8
  pour Top (no thermals): 160.7,95.7 160.7,97.65 161.6,97.65 161.6,95.7
C4+
  Top 1.6: J33C.1 CELL4.+
C4_FUSED
  Top 1: T25B.3 166.95,104.2 168.2,105.45 168.2,110.85 165.8,113.25 F33C.2
CD1  (via drill 0.2 pad 0.4)
  Top 0.15: U10.75 v154.85,40.5
  Route15 0.15: v144.5,87.3 144.8,87 144.8,84.45 142.25,81.9 142.25,65.85 154.85,53.25 v154.85,40.5
  Bottom 0.15: 144.5,90.3 144.65,90.45 T20S.G
  Bottom 0.4: v144.5,87.3 144.5,90.3
  Bottom 0.6: R20L.2 R20D.2 144.65,90.7 144.65,90.45
CD2  (via drill 0.2 pad 0.4)
  Top 0.15: U10.74 155.05,40 v155.3,39.75
  Route15 0.15: v155.3,39.75 155.3,53.55 142.7,66.15 142.7,81.6 150.35,89.25 150.35,93.45 149.15,94.65 146.6,94.65 146,94.05 v144.95,94.05
  Bottom 0.15: 144.95,97.55 T21S.G
  Bottom 0.4: v144.95,94.05 144.95,97.55
  Bottom 0.6: R21L.2 R21D.2 144.75,97.9 T21S.G
CD3  (via drill 0.2 pad 0.4)
  Top 0.15: U10.73 154.35,39.5 155.15,38.7 v155.75,38.7
  Route15 0.15: v155.75,38.7 155.75,53.85 143.15,66.45 143.15,81.3 151.1,89.25 151.1,99.9 149.9,101.1 149.75,101.25 149.15,101.85 146.45,101.85 145.85,101.25 v144.95,101.25
  Bottom 0.15: 144.95,104.75 T22S.G
  Bottom 0.4: v144.95,101.25 144.95,104.75
  Bottom 0.6: R22L.2 R22D.2 144.6,105.1 T22S.G
CELL1+
  Top 0.6: R31C.1 23.53,71.7 J30C.2
  Top 1: F30C.1 77.9,91.95 53,116.85 CELL2.- 52.93,153.82 | R30B.2 J31B.1
  Top 1.6: J31B.1 52.93,153.82
  Bottom 2: J30C.2 29.23,72.23 43.55,86.55 43.55,144.3 CELL2.-
CELL2+
  Top 0.6: R33C.1 53.53,71.7 J31C.2
  Top 1: R31B.2 J32B.1 | F31C.1 100.55,99.15 83,116.7 CELL3.- 83.08,153.83
  Top 1.6: J32B.1 83.08,153.83
  Bottom 2: J31C.2 59.23,72.23 73.7,86.7 73.7,144.45 CELL3.-
CELL3+
  Top 0.6: R35C.1 83.53,71.7 J32C.2
  Top 1: F32C.1 123.5,106.35 113,116.85 113,153.6 | R32B.2 J33B.1
  Top 1.6: J33B.1 113,157.95 CELL4.- 113,153.6
  Bottom 2: J32C.2 89.23,72.23 103.7,86.7 103.7,144.45 CELL4.-
CELL4+  (via drill 0.2 pad 0.4)
  Top 0.15: U30.4 116.05,38.3 115.4,37.65 113.15,37.65 113,37.8 113,38.7 114.13,38.7 R31P.2 | R30P.2 v111.8,39.8
  Top 0.4: R01C.2 v126.6,75.6
  Top 0.5: v132.65,113.25 F33C.1 | v132.65,113.25 v132.65,113.8 | v132.65,113.25 v132.65,112.75
  Top 0.6: R37C.1 113.53,71.85 J33C.2
  Top 1: R33B.2 120.9,145.8 133.4,145.8 | D02P.A 133.4,145.8 | F33C.1 F34C.1 133.4,145.8
  Bottom 0.4: v126.6,75.6 120.95,75.6 120.8,75.45
  Bottom 1.6: J33C.2 118.63,72.38 120.8,74.55 120.8,75.45 120.8,107.55 126.5,113.25 v132.65,113.25
  other vias: 111.2,39.8 112.4,39.8 114.2,39.8 113.6,39.8 114.8,39.8
  pour Route15 (isolate 0.5): 110.75,39.45 110.75,73.5 115,73.5 115,39.45
  pour Top (no thermals): 110.9,38.25 110.9,40.05 115.1,40.05 115.1,38.25
CHARGE_ENA  (via drill 0.2 pad 0.4)
  Top 0.15: U10.38 136.85,34.5 136.4,34.05 136.4,30.9 v135.05,29.55
  Top 0.4: v87.2,4.05 LD31I.A
  Route15 0.15: v101,23.85 92.9,23.85 87.2,18.15 v87.2,4.05
  Bottom 0.15: v135.05,29.55 106.55,29.55 103.25,26.25 103.25,26.05 Z30I.2
  Bottom 0.4: v101,23.85 101.75,23.85 T31I.G
  Bottom 0.5: T31I.G 101.95,23.75 R32I.1 103.4,25.5 103.15,25.5 Z30I.2
CU2  (via drill 0.2 pad 0.4)
  Top 0.15: U10.78 167,42 v174.95,49.95
  Bottom 0.15: v174.95,49.95 174.95,83.25 170.15,88.05 160.4,88.05 158.75,89.7 158.75,90.3 158.6,90.45 158.35,90.45 T23S.G 158.15,90.45 157.85,90.15
  Bottom 0.6: R23L.2 R23D.2 157.9,90.7 158.15,90.45 | T23S.G 158.12,90.68
CU3  (via drill 0.2 pad 0.4)
  Top 0.15: U10.77 167.85,41.5 v176,49.65
  Bottom 0.15: 158.3,97.7 T24S.G 158.5,97.5 158.75,97.5 158.75,96.6 160.1,95.25 168.8,95.25 176,88.05 v176,49.65 | 157.85,97.65 158,97.65 158.18,97.83
  Bottom 0.6: R24L.2 R24D.2 158.1,97.9 T24S.G 158.18,97.83
CU4  (via drill 0.2 pad 0.4)
  Top 0.15: U10.76 168.7,41 v177.05,49.35
  Bottom 0.15: 158.3,104.9 T25S.G | v177.05,49.35 177.05,92.7 166.7,103.05 159.5,103.05 158.75,103.8 158.75,104.7 158.5,104.7 158.18,105.03
  Bottom 0.6: R25L.2 R25D.2 158.25,105.1 T25S.G 158.18,105.03 158.12,105.08
DH  (via drill 0.2 pad 0.4)
  Top 0.15: TOP.1 154.61,75.65 v155.45,75.65 TOP.1 154.55,75.6
  other vias: 155.45,76.15 155.45,75.15
  pour Bottom (no thermals): 160.85,75.3 156.95,75.3 156.95,76.35 155.15,76.35 155.15,73.5 160.85,73.5
DISCHARGE_ENA  (via drill 0.2 pad 0.4)
  Top 0.15: U10.39 137.1,34 136.85,33.75 136.85,30.15 v135.65,28.95 135.65,8.85 138.95,5.55 LD31O.A
  Bottom 0.15: v135.65,28.95 122.45,28.95 121.85,28.35 121.85,24.75 122.15,24.45 122.7,24.45 R32O.1
  Bottom 0.5: T32O.G 124.35,24.5 R32O.1 122.75,22.6 Z30O.2
DL  (via drill 0.2 pad 0.4)
  Top 0.15: v160.4,62.65 BOT.1
  Top 0.4: v160.4,62.65 160.39,62.65
  Top 0.5: v160.4,63.2 v160.4,62.65 v160.4,62.1
  pour Bottom (no thermals): 161,63.5 160.15,63.5 160.15,61.8 161,61.8
G0  (via drill 0.2 pad 0.4)
  Top 0.3: R20A.2 v147.25,93.45
  Top 0.4: R20B.1 v145.55,88.35
  Route15 0.3: v145.55,88.35 145.55,91.75 v147.25,93.45
  Bottom 0.15: R20S.1 148.4,92.32
  Bottom 0.6: 149.58,92.3 C20G.2 | Z20G.1 151.95,93.75 R20P.2 C20P.1
  pour Bottom (no thermals): 147.95,91.8 147.95,92.4 146.3,92.4 146.3,93.9 152.3,93.9 152.3,91.8
G1  (via drill 0.2 pad 0.4)
  Top 0.3: R21B.1 v145.55,95.4
  Top 0.4: R21A.2 v147.2,100.8
  Route15 0.3: v145.55,95.4 145.55,99.15 v147.2,100.8
  Bottom 0.6: Z21G.1 151.95,100.95 R21P.2 C21P.1
  pour Bottom (no thermals): 147.95,99 147.95,99.6 146.3,99.6 146.3,101.1 152.3,101.1 152.3,99
G2  (via drill 0.2 pad 0.4)
  Top 0.4: R22A.2 v147.2,108 | R22B.1 v145.55,102.6
  Route15 0.3: v145.55,102.6 145.55,106.35 v147.2,108
  Bottom 0.4: 151.95,108.15 Z22G.1
  Bottom 0.6: C22P.1 R22P.2
  Bottom 0.8: R22P.2 151.95,108.15
  pour Bottom (no thermals): 147.95,106.2 147.95,106.8 146.3,106.8 146.3,108.3 152.3,108.3 152.3,106.2
G3  (via drill 0.2 pad 0.4)
  Top 0.3: v159.8,93.45 R23B.2
  Top 0.4: R23A.1 v159.2,88.35
  Route15 0.3: v159.2,88.35 159.2,92.85 v159.8,93.45
  Bottom 0.3: R23P.2 158.6,88.95 v159.2,88.35
  Bottom 0.6: C23P.1 R23P.2
  pour Bottom (no thermals): 161.45,91.8 161.45,92.4 159.8,92.4 159.8,93.9 165.8,93.9 165.8,91.8
G4  (via drill 0.2 pad 0.4)
  Top 0.3: v159.8,100.65 R24B.2
  Top 0.4: v159.2,95.4 R24A.1
  Route15 0.3: v159.2,95.4 159.2,100.05 v159.8,100.65
  Bottom 0.3: R24P.2 158.45,96.15 v159.2,95.4
  Bottom 0.5: C24P.1 155.15,94.65
  Bottom 0.6: R24S.1 161.92,99.52 | 155.15,94.65 R24P.2
  pour Bottom (no thermals): 161.45,99 161.45,99.6 159.8,99.6 159.8,101.1 165.8,101.1 165.8,99
G5  (via drill 0.2 pad 0.4)
  Top 0.3: v159.2,102.6 R25A.1 | v159.8,107.85 R25B.2
  Route15 0.3: v159.2,102.6 159.2,107.25 v159.8,107.85
  Bottom 0.3: R25P.2 158.45,103.35 v159.2,102.6
  Bottom 0.6: C20P5.1 155.15,101.8 R25P.2
  pour Bottom (no thermals): 161.45,106.2 161.45,106.8 159.8,106.8 159.8,108.3 165.8,108.3 165.8,106.2
GND  (via drill 0.2 pad 0.4)
  Top 1: 23.23,153.98 CELL1.-
  Top 1.6: J30B.1 23.23,153.98
  other vias: 142.2,47.8 144.05,39.15 145.85,39.15 145.85,37.35 144,37.35 140.65,85.5 139.15,85.5 141.65,84 145.85,86.45 144.2,86.45 135.65,87.05 136.5,85.5 145.05,28.85 140.2,28.8 154.35,43 88.1,16.65 88.1,15 138.5,14.1 127.35,70.15 128.8,70.15 123.45,37.35 122.6,38.85 118.9,36.4 154.2,34 135.5,39.1 142.85,14.1 160.05,66.45 160.8,66.45 161.7,66.45 165.15,69 168.3,69 166.05,67.8 166.05,65.1 163.2,68.7 162,68.7 160.8,68.55 160.8,81.6 144.8,81.6 145.95,80.55 147,79.35 148.35,79.95 148.35,82.05 157.2,82.05 157.2,79.95 158.4,79.35 159.6,80.25 159.15,83.25 146.25,83.25 145.65,82.2 160.05,82.2 161.3,84.55 159.6,84.55 159.05,86.25 146.5,86.3 148.35,81 157.2,81 144.8,80.15 160.85,80.1 138,78.25 167.65,78.25
  pour Top (isolate 0.2, rank 2): 180,156 180,0 0,0 0,156
  pour Bottom (isolate 0.2, rank 2): 180,156 180,0 0,0 0,156
  pour Route15 (isolate 0.2, rank 2): 180,156 180,0 0,0 0,156
HB  (via drill 0.2 pad 0.4)
  Top 0.4: v165.65,71.85 165.65,71.55 | 165.65,71.55 v165.65,71.25 | C20BST.1 165.65,71.55
  Top 0.45: v165.65,71.85 166.45,71.85 | v165.65,71.25 166.45,71.25
  Bottom 0.4: 165.65,71.55 166.01,71.55 U20D.2 | 165.65,71.55 v165.65,71.85 | 165.65,71.55 v165.65,71.25
HI_PWM  (via drill 0.2 pad 0.4)
  Top 0.15: U10.8 146.2,55.55 149.15,58.5 v168.61,58.5
  Bottom 0.15: U20D.5 v168.61,58.5
HO
  pour Bottom (no thermals): 166.85,70.5 166.85,73.5 162.5,73.5 162.5,75.3 167.9,75.3 167.9,70.5
HS  (via drill 0.2 pad 0.4)  (1 unrouted)
  Top 0.15: BOT.4 154.6,63.7 | 168.25,71.25 168.25,71.35 168.2,71.4
  Top 0.4: BOT.4 154.5,64.95 154.5,64.2 154.45,64.25 | 168.95,71.55 C20BST.2 168.2,71.4 168.2,70.35 167.9,70.05 164.6,70.05 164,70.65 155,70.65 154.61,71.04 TOP.3 | v168.95,71.25 v168.95,71.85
  Top 0.45: v168.95,71.85 168.25,71.85 | v168.95,71.25 168.25,71.25
  Bottom 0.4: v168.95,71.25 v168.95,71.85 168.65,71.85 168.65,71.64 U20D.4
  pour Top (isolate 0.3, no thermals): 155.6,63 147.5,63 147.5,68.85 153.05,68.85 153.05,71.55 155.6,71.55
HSIGN  (via drill 0.2 pad 0.4)
  Top 0.15: U10.72 154.1,39 155,38.1 v171.8,38.1
  Top 0.4: v161.3,85.5 U21.2
  Bottom 0.15: v161.3,85.5 171.8,75 v171.8,52.35 v171.8,38.1
I_HI  (via drill 0.2 pad 0.4)
  Top 0.15: U10.9 145.7,56.25 148.7,59.25 v173.3,59.25
  Top 0.2: U21B.1 166.8,86.45 167,86.25 167,84.75 167.2,84.55 U21B.4
  Top 0.4: U21B.4 v168.4,84.08
  Bottom 0.15: v168.4,84.08 173.3,79.18 v173.3,59.25
I_HI*
  Top 0.4: R21F.2 C23F.2 164,84.55 U21B.3
I_LO
  Top 0.15: 139.85,84.5 139.85,83.25 139.25,82.65 137.15,82.65 135.5,81 135.5,70.35 145.25,60.6 145.2,60.55 U10.10
  Top 0.2: U20B.1 138.7,84.55 138.5,84.75 138.5,86.25 138.3,86.45 U20B.4
  Top 0.4: U20B.1 139.85,84.5
I_LO*
  Top 0.4: U20B.3 141.5,86.45 C21F.2
  Top 0.6: R20F.2 C21F.2
I_LO*1
  Top 0.4: U30B.3 122.75,36.4 C30S.2 122.58,36.53
  Top 0.5: 121.27,36.53 122.58,36.53
  Top 0.6: 121.27,36.53 R30S.2
I_PACK  (via drill 0.2 pad 0.4)
  Top 0.15: 124.4,38.35 U30B.1 125.55,38.3 125.75,38.1 125.75,37 v126.35,36.4 | U10.42 140.7,32.75 v140.6,32.85
  Top 0.4: U30B.4 v126.35,36.4
  Bottom 0.15: v140.6,32.85 140.45,33 131.15,33 130.7,33 129.75,33 v126.35,36.4
LED_BMS  (via drill 0.2 pad 0.4)
  Top 0.15: U10.69 153.65,37.5 154.4,36.75 v156.35,36.75
  Top 0.5: v156.5,49.8 R14L.1
  Route15 0.15: v156.35,36.75 156.35,49.65 v156.5,49.8
LED_BOOST
  Top 0.15: U10.6 147.2,52.95 150.35,56.1 R13L.1
LED_BUCK
  Top 0.15: 157.18,52.95 R12L.1 150.35,52.95 147.7,50.3 U10.5
LED_GRN
  Top 0.15: U10.46 142.7,21.6 GRN.1
  Top 0.6: R11L.1 GRN.1
LED_RED
  Top 0.15: U10.45 142.2,25.15 RED.1
  Top 0.6: R10L.1 RED.1
LO
  pour Bottom (no thermals): 162.05,61.9 162.05,67.45 164.75,67.45 164.75,61.9
LO_PWM  (via drill 0.2 pad 0.4)
  Top 0.15: U10.2 149.2,46.6 v148.85,46.95
  Bottom 0.15: U20D.6 167.33,57.03 158.45,48.15 149.9,48.15 148.85,47.1 v148.85,46.95
LSIGN  (via drill 0.2 pad 0.4)
  Top 0.15: U10.4 148.2,46.15 v148.25,46.2
  Top 0.4: v144.2,85.5 U20.2
  Route15 0.15: v144.2,85.5 144.2,84.75 141.8,82.35 141.8,65.4 148.25,58.95 v148.25,46.2
MCO
  Top 0.15: U10.56 147.7,27.65 MCO.1
N$1  (via drill 0.2 pad 0.4)
  Top 0.4: LD22.A v142.1,107.85
  Bottom 0.4: R22L.1 141.9,107.65 v142.1,107.85
N$2  (via drill 0.2 pad 0.4)
  Top 0.4: LD21.A v142.1,100.65
  Bottom 0.4: R21L.1 141.9,100.45 v142.1,100.65
N$3
  Top 0.4: T23B.1 161.95,92.15 R23B.1
N$4  (via drill 0.2 pad 0.4)
  Top 0.4: LD20.A v142.1,93.45
  Bottom 0.4: R20L.1 141.9,93.25 v142.1,93.45
N$5
  Top 0.6: T24B.1 161.95,99.35 R24B.1
N$6
  cutout Top: 152.9,74.7 152.9,76.65 156.2,76.65 156.2,74.7
  cutout Top: 159.05,61.65 159.05,63.65 162.35,63.65 162.35,61.65
  cutout Top: 147.05,63 147.05,77.1 147.2,77.1 147.2,63
N$7
  Top 0.4: U30.3 121.1,38.3 R30S.1
N$8
  Top 0.6: R14L.2 LD13-Y.A
N$9
  Top 0.6: R21A.1 148.3,99.4 148.4,99.3 148.4,99.25 T21A.1
N$10
  Top 0.6: R21B.2 143.25,96.85 T21B.1
N$11
  Top 0.6: T20A.1 148.3,92.15 R20A.1
N$12  (via drill 0.2 pad 0.4)
  Top 0.5: LD31I.C v87.2,0.9
  Bottom 0.5: v87.2,0.9 R31L.1
N$13
  Top 0.6: R22B.2 143.25,104.05 T22B.1
N$14
  Top 0.15: 143.15,88.2 143.15,88.25 R20B.2
  Top 0.6: T20B.1 143.25,89.65 R20B.2
N$15
  Top 0.4: R22A.1 148.3,106.55 T22A.1
N$16
  Top 0.4: R23A.2 156.9,89.65 T23A.1
N$17
  Top 0.6: R25B.1 161.95,106.55 T25B.1
N$18
  Top 0.6: R24A.2 156.9,96.85 T24A.1
N$19
  cutout Top: 147.05,83.4 147.05,87.6 158.45,87.6 158.45,83.4
N$20
  Bottom 0.6: T22S.D 147.75,105.1 R22S.2
N$21
  Bottom 0.6: T21S.D 147.75,97.9 R21S.2
N$22
  Bottom 0.6: T20S.D 147.75,90.7 R20S.2
N$23
  Top 0.8: R11L.2 LD11-G.A
N$24
  Top 0.6: T25A.1 156.9,104.05 R25A.2
N$25
  Bottom 0.6: T23S.D 161.25,90.7 R23S.2
N$28
  Bottom 0.6: T24S.D 161.25,97.9 R24S.2
N$29
  Top 0.8: R20SN.2 C20SN.1
N$30
  Bottom 0.6: T25S.D 161.25,105.1 R25S.2
N$31  (via drill 0.2 pad 0.4)
  Top 0.4: LD23.A 163.9,93.47 v163.9,94.3
  Route15 0.15: v163.9,94.3 156.9,94.3 v155.6,93
  Bottom 0.3: R23L.1 155.45,92.85 v155.6,93
N$32  (via drill 0.2 pad 0.4)
  Top 0.4: LD24.A 163.85,100.72 v163.85,101.5
  Route15 0.15: v163.85,101.5 156.75,101.5 v155.6,100.35
  Bottom 0.15: R24L.1 155.6,99.65 v155.6,100.35
N$33  (via drill 0.2 pad 0.4)
  Top 0.4: LD25.A 163.85,107.92 v163.85,108.75
  Route15 0.15: v155.6,107.4 156.95,108.75 v163.85,108.75
  Bottom 0.15: v155.6,107.4 155.6,106.85 R25L.1
N$34
  Top 0.4: U20.3 143.3,84.55 R20F.1
N$35
  Top 0.8: R12L.2 LD12-R.A
N$36
  Top 0.8: R13L.2 LD13-G.A
N$38  (via drill 0.2 pad 0.4)
  Top 0.5: LD31O.C v138.95,0.9
  Bottom 0.5: v138.95,0.9 LD31O.C
  Bottom 0.6: LD31O.C R33L.1
N$39
  Top 0.8: LD10-R.A R10L.2
N$40
  Top 0.4: U21.3 162.2,86.45 R21F.1
N$42
  Top 1: R30B.1 J30B.2
N$43
  Top 1: R31B.1 J31B.2
N$44
  cutout Route15: 176.95,150.1 arc90 174.95,148.1 174.95,136.1 arc90 176.95,134.1 arc90 178.95,136.1 178.95,148.1 arc90
  cutout Route2: 176.95,150.1 arc90 174.95,148.1 174.95,136.1 arc90 176.95,134.1 arc90 178.95,136.1 178.95,148.1 arc90
N$45
  Top 1: R32B.1 J32B.2
N$46
  cutout Top: 0.4,136.5 0.4,143.25 2.95,143.25 2.95,136.5
  cutout Bottom: 0.4,136.5 0.4,143.25 2.95,143.25 2.95,136.5
  cutout Route15: 0.4,136.5 0.4,143.25 2.95,143.25 2.95,136.5
  cutout Route2: 0.4,136.5 0.4,143.25 2.95,143.25 2.95,136.5
N$47
  Top 1: J33B.2 R33B.1
OLED_BL
  Top 0.15: DSP11.10 91.32,43.05 128.9,43.05 133.45,38.5 U10.30
OLED_CD
  Top 0.15: U10.32 133.25,37.5 128.45,42.3 95.65,42.3 DSP11.8
OLED_MISO  (via drill 0.2 pad 0.4)
  Top 0.15: U10.36 135.9,35.5 135.05,34.65 v135.05,31.1
  Bottom 0.15: DSP11.5 92.07,31.1 v135.05,31.1
OLED_MOSI  (via drill 0.2 pad 0.4)
  Top 0.15: U10.37 136.45,35 135.8,34.35 v135.8,31.8
  Bottom 0.15: DSP11.6 90.23,31.8 v135.8,31.8
OLED_SCK  (via drill 0.2 pad 0.4)
  Top 0.15: U10.35 135.2,36 134.3,35.1 v134.3,30.3
  Bottom 0.15: DSP11.4 93.81,30.3 v134.3,30.3
PACK
  Top 0.15: U30.6 116.05,36.4 115.4,37.05 113.15,37.05 113,36.9 113,36.3
  Top 0.4: 121.85,33.3 121.85,32.3 | R30I.1 102.85,28.59 T30I.3
  Top 0.6: R30O.1 121.85,33.75 121.85,33.3
  pour Top (isolate 0.5, no thermals): 122.3,30.15 122.3,34.2 115.25,34.2 115.25,36.45 110.75,36.45 110.75,34.2 106.7,34.2 106.7,24.6 115.25,24.6 115.25,30.15
PSIGN
  Top 0.15: U30.2 118.55,37.35 118.25,37.05 118.25,35.7 118.7,35.25 125.45,35.25 125.9,34.8 132.8,34.8 134.5,36.5 U10.34
S0  (via drill 0.2 pad 0.4)
  Top 0.4: T20A.2 146.55,91.6 | 145.25,90.3 145.25,90.05 T20B.2
  other vias: 146.45,89.3 146.45,89.85
  pour Bottom (no thermals): 149.15,91.2 149.15,89.85 146.3,89.85 146.3,89.1 152.3,89.1 152.3,91.2
  pour Top (no thermals): 144.95,89.15 144.95,92.55 146.6,92.55 146.6,89.15
S1  (via drill 0.2 pad 0.4)
  Top 0.4: 145.25,97.25 T21B.2
  Bottom 0.3: Z21G.2 148.35,97
  other vias: 146.45,97.05 146.45,96.5
  pour Bottom (no thermals): 149.15,98.4 149.15,97.05 146.3,97.05 146.3,96.3 152.3,96.3 152.3,98.4
  pour Top (no thermals): 144.95,96.35 144.95,99.75 146.6,99.75 146.6,96.35
S2  (via drill 0.2 pad 0.4)
  Top 0.4: 145.25,104.7 145.25,104.45 T22B.2
  other vias: 146.45,104.25 146.45,103.7
  pour Bottom (no thermals): 149.15,105.6 149.15,104.25 146.3,104.25 146.3,103.5 152.3,103.5 152.3,105.6
  pour Top (no thermals): 144.95,103.55 144.95,106.95 146.6,106.95 146.6,103.55
S3  (via drill 0.2 pad 0.4)
  Top 0.6: T23A.2 158.75,89.9 158.75,90
  other vias: 159.95,89.85 159.95,89.3
  pour Bottom (no thermals): 162.65,91.2 162.65,89.85 159.8,89.85 159.8,89.1 165.8,89.1 165.8,91.2
  pour Top (no thermals): 158.6,89.15 158.6,92.55 160.25,92.55 160.25,89.15
S4  (via drill 0.2 pad 0.4)
  Bottom 0.6: Z24G.2 164.45,97
  other vias: 159.95,97.05 159.95,96.5
  pour Bottom (no thermals): 162.65,98.4 162.65,97.05 159.8,97.05 159.8,96.3 165.8,96.3 165.8,98.4
  pour Top (no thermals): 158.6,96.35 158.6,99.75 160.25,99.75 160.25,96.35
S5  (via drill 0.2 pad 0.4)
  Top 0.6: T25A.2 158.6,104.25 | 160.25,106.5 160.2,106.45 T25B.2
  other vias: 159.95,104.25 159.95,103.7
  pour Bottom (no thermals): 162.65,105.6 162.65,104.25 159.8,104.25 159.8,103.5 165.8,103.5 165.8,105.6
  pour Top (no thermals): 158.6,103.55 158.6,106.95 160.25,106.95 160.25,103.55
SER_RXD
  Top 0.15: U10.58 148.7,7.3 J10U.1
  Bottom 0.4: D10U.C J10U.1
SER_TXD
  Top 0.15: U10.57 148.2,5 151.4,1.8 153.5,1.8 J10U.2
  Bottom 0.4: D11U.C J10U.2
SWD_CLK
  Top 0.15: J10P.2 163.1,1.8 161.45,1.8 150.2,13.05 150.2,34.65 150.35,34.8 150.55,35 U10.64
  Bottom 0.4: D11P.C J10P.2
SWD_IO
  Top 0.15: J10P.1 150.5,15.1 150.5,34.2 150.8,34.5 U10.63
  Bottom 0.4: D10P.C J10P.1
TOUCH_SCL  (via drill 0.2 pad 0.4)
  Top 0.15: v145.7,35.55 U10.52
  Top 0.2: U10.52 145.7,30.3 R10I.1
  Bottom 0.15: DSP11.14 124.51,46.09 135.05,35.55 v145.7,35.55
TOUCH_SDA  (via drill 0.2 pad 0.4)
  Top 0.15: v146.15,34.8 146.15,31.57 U10.53
  Top 0.2: U10.53 146.2,30.85 146.6,30.45 R11I.1
  Bottom 0.15: v146.15,34.8 146,34.95 135.05,34.95 126.45,43.55 DSP11.13
V_CHARGER
  Top 0.5: R01A.2 93.65,14.5
  Top 0.6: 104.9,16.5 104.9,17.65 T30I.2 | 93.65,14.5 J01I.+
  Bottom 1: D30P.1 99.6,8.55 J01I.+
  pour Top (isolate 0.5, no thermals): 93.35,8.25 93.35,14.7 101.3,14.7 101.3,19.95 105.2,19.95 105.2,14.4 98.9,8.25
V_LOAD
  Top 0.4: 123.3,21.66 T30O.3
  Bottom 1: D31P.1 126.55,8.55 J01O.+
  pour Top (isolate 0.5, no thermals): 125.75,8.55 125.75,25.65 132.5,25.65 132.5,8.55
VBOOST  (via drill 0.2 pad 0.4)
  Top 0.15: v137.15,41.7 137.35,41.5 U10.24
  Top 0.4: v166.05,76.9 R02T.2
  Top 0.6: R01T.1 R02T.2 C01T.1
  Bottom 0.15: v166.05,76.9 167.5,76.9 170,74.4 170,54.45 160.25,44.7 140.15,44.7 v137.15,41.7
VBUCK  (via drill 0.2 pad 0.4)
  Top 0.15: U10.25 139.35,41 v139.4,40.95
  Top 0.4: 139.55,77.48 v139.55,76.95
  Top 0.6: C01K.1 R02K.2 | R01K.1 R02K.2 | R02K.2 139.6,77.53 139.55,77.48
  Route15 0.15: v139.55,76.95 139.55,41.1 v139.4,40.95
VCELL1
  Top 0.15: VCELL1.1 38.75,57.6 140.15,57.6 141.5,56.25 141.5,46.05 141.7,45.85 U10.17
  Top 0.6: C30C.1 R30C.1 R31C.2 | R31C.2 VCELL1.1 | R31C.2 29.5,71.7 Z20C.2
VCELL2
  Top 0.15: 57.5,69 57.5,68.7 63.05,63.15 89,63.15 94.1,58.05 140.6,58.05 143.2,55.45 U10.14
  Top 0.6: R33C.2 57.5,69 VCELL2.1 | C31C.1 R32C.1 R33C.2 | R33C.2 59.5,71.7 Z21C.2
VCELL3
  Top 0.15: U10.13 143.7,55.85 141.05,58.5 99.35,58.5 99.2,58.5 97.7,58.5 87.28,68.92
  Top 0.6: 87.28,68.92 VCELL3.1 87.5,69 R35C.2 | R34C.1 C32C.1 R35C.2 | R35C.2 89.5,71.7 Z22C.2
VCELL4
  Top 0.15: U10.12 144.2,57.75 135.5,66.45 119.75,66.45 VCELL4.1
  Top 0.6: C33C.1 R36C.1 R37C.2 | R37C.2 119.5,71.85 Z23C.2 | R37C.2 117.5,69 VCELL4.1
VCELLS
  Top 0.15: C01C.1 131.35,72.55 144.7,59.2 U10.11
  Top 0.6: C01C.1 R02C.2 R01C.1
VCHARGE  (via drill 0.2 pad 0.4)  (1 unrouted)
  Top 0.15: U10.43 v141.2,29.7
  Top 0.4: v90.7,14.1 90.7,15.22
  Top 0.6: R01A.1 R02A.2 C01A.1
  Route15 0.15: v141.2,29.7 141.2,13.2 131.6,3.6 95.6,3.6 90.7,8.5 v90.7,14.1
VD+
  Top 0.2: U20.4 149.25,84.55 149.9,85.2 151.1,85.2 151.25,85.05 R20C.1
  Top 0.4: 150.78,84.55 R20C.1 | VBCK.1 151.1,77.55 151.25,77.7
  Top 0.8: R01K.2 VBCK.1
  Top 1: 148.7,72.6 148.85,72.45
  Top 1.5: R20C.1 151.25,81.05
  Bottom 0.8: R20N.1 VBCK.1
  Bottom 1: Z20N.1 VBCK.1
  pour Top (isolate 0.3, no thermals): 147.5,70.65 147.5,78.45 150.2,78.45 150.2,82.95 152.3,82.95 152.3,70.65
VD-
  Top 0.2: U20.6 149.1,86.45 149.75,85.8 151.1,85.8 151.25,85.95 R20C.2
  Top 0.4: 150.78,86.45 R20C.2
  Top 0.6: 151.25,97.8 151.25,96.9 151.25,89.85 151.25,89.7 R20C.2
  Top 1: 151.2,89.8 151.25,89.85 | T21A.3 151.15,97 151.25,96.9 | 151.25,104.1 151.15,104.2 T22A.3 | T20A.3 151.15,89.8 151.25,89.7
  pour Top (isolate 0.3, no thermals): 150.5,86.25 150.5,106.95 152,106.95 152,86.25
VDD_3V3  (via drill 0.2 pad 0.4)
  Top 0.15: U10.80 C12D.1
  Top 0.2: U10.41 C11D.1 | U10.16 C10D.1 | U10.62 C14D.1 | U10.51 145.2,30.3 C13D.1 | U10.1 149.7,46.15 C11A.1
  Top 0.4: U20.5 v148.7,85.5 | v156.8,85.5 U21.5 | L10A.1 v135.5,39.9 | R10A.2 v172.35,19.5 | C12D.1 v153,43.4 | R10I.2 v146.2,29.25 R11I.2 | C11D.1 v139.85,30.1 | v144.7,30.15 C13D.1 | v116.05,37.35 C31S.1 | C14D.1 v152.9,33.6 | C11A.1 149.75,46.6 v149.85,46.7 | C10D.1 v142.2,46.8 | U30B.5 128.6,38.3 C30B.1 v128.6,38.9 | v135.65,84.05 C20B.1 135.65,84.55 | U21B.5 169.7,86.45 C21B.1 v169.85,86.98
  Top 0.5: U20B.5 135.65,84.55 | R10R.2 170.7,29 v170.7,28.35
  Bottom 0.4: C31S.1 v116.05,37.35 | R10D.1 v80.7,33.4 | C20S.1 v148.7,85.5 | C22S.1 v156.8,85.5
  Bottom 0.8: C02P.1 DC01P.3
  pour Route2 (isolate 0.2, rank 2): 180,160 180,0 0,0 0,77 131,77 131,160
VDD_12V
  Top 1: D01P.A 144.8,149.7 143.97,150.53 J01P.1
VDDA1
  Top 0.2: U10.29 136.95,39 C10A.1 | U10.28 136.85,39.5 136.85,39.45
  Top 0.4: C10A.1 136.85,39.45 L10A.2
VSYS  (via drill 0.2 pad 0.4)
  Top 0.8: D01P.C D02P.C 140.6,139.35 140.16,138.91 DC01P.1
  Route2 0.4: DC01P.1 140.16,133.04 141.5,131.7 172.4,131.7 178.7,125.4 178.7,83.55 169.25,74.1 162.2,74.1 v159.35,71.25
  Bottom 0.3: 164.72,71.02 164.8,71.1
  Bottom 0.5: v159.35,71.25 159.5,71.1 C22D.1
  Bottom 0.6: U20D.1 164.8,71.1 164.8,71 C21D.1 C20D.1 160.5,71 C22D.1 160.4,71.02
  Bottom 0.8: C01P.1 DC01P.1
VU+
  Top 0.2: U21.6 156.4,84.55 155.75,85.2 154.4,85.2 154.25,85.05 154.25,84.15
  Top 0.4: VBST.1 154.4,77.55 154.25,77.7 | 154.25,84.15 RS20U.1
  Top 0.8: R01T.2 VBST.1
  Top 1.6: RS20U.1 154.25,81.05
  Bottom 0.8: R20U.1 VBST.1
  Bottom 1: VBST.1 Z20U.1
  pour Top (isolate 0.3, no thermals): 153.05,82.95 153.05,72.3 160.1,72.3 160.1,75 157.55,75 157.55,78.45 155.45,78.45 155.45,82.95
VU-
  Top 0.2: 154.25,91.65 RS20U.2 | U21.4 156.4,86.45 155.75,85.8 154.4,85.8 154.25,85.95 154.25,86.7 154.1,86.85 154.25,86.85
  Top 0.4: 154.25,86.85 RS20U.2
  Top 1: T25A.3 154.3,106.4 154.25,106.35 154.25,99.3 154.35,99.2 T24A.3 | T23A.3 154.2,92 154.1,92.1 154.1,91.8 154.25,91.65
  pour Top (isolate 0.3, no thermals): 153.5,86.4 153.5,106.95 155,106.95 155,86.4
VX  (via drill 0.2 pad 0.4)
  Top 0.5: F34C.2 v137.9,120.15
  Bottom 0.4: R23P.1 R20P.1 R24P.1 | R21P.1 R25P.1 R22P.1 153.55,114.25 147.65,120.15 v137.9,120.15
  Bottom 0.5: R24P.1 R21P.1

## Text on the board
Top: 1
Route2: 2
Route15: 3
Bottom: 4
tPlace: GND | +12V | C4 | C3 | C2 | GND | C1 | GND | BOOST MODE | BUCK MODE | BMS ON | SERIAL | DEBUG | CHARGE SHUTTLING BMS | 261017-v1.1 | CHARGER | LOAD
tRestrict: CADWEAZLE
bRestrict: CADWEAZLE